# EasyEDA Pro project STM32-Environment-Monitor-SMD-DRAFT.epro

# Schematic Schematic1

## Sheets
1 P1: Assembly Variant: Basic; Board Name: Board1; Create Date: 2026-11-10; Page Name: P1; Project Name: 基于STM32的多功能环境智能监控系统; Schematic Name: Schematic1; Update Date: 2026-11-10; Company: 嘉立创EDA; Page Size: A4; Version: V1.0
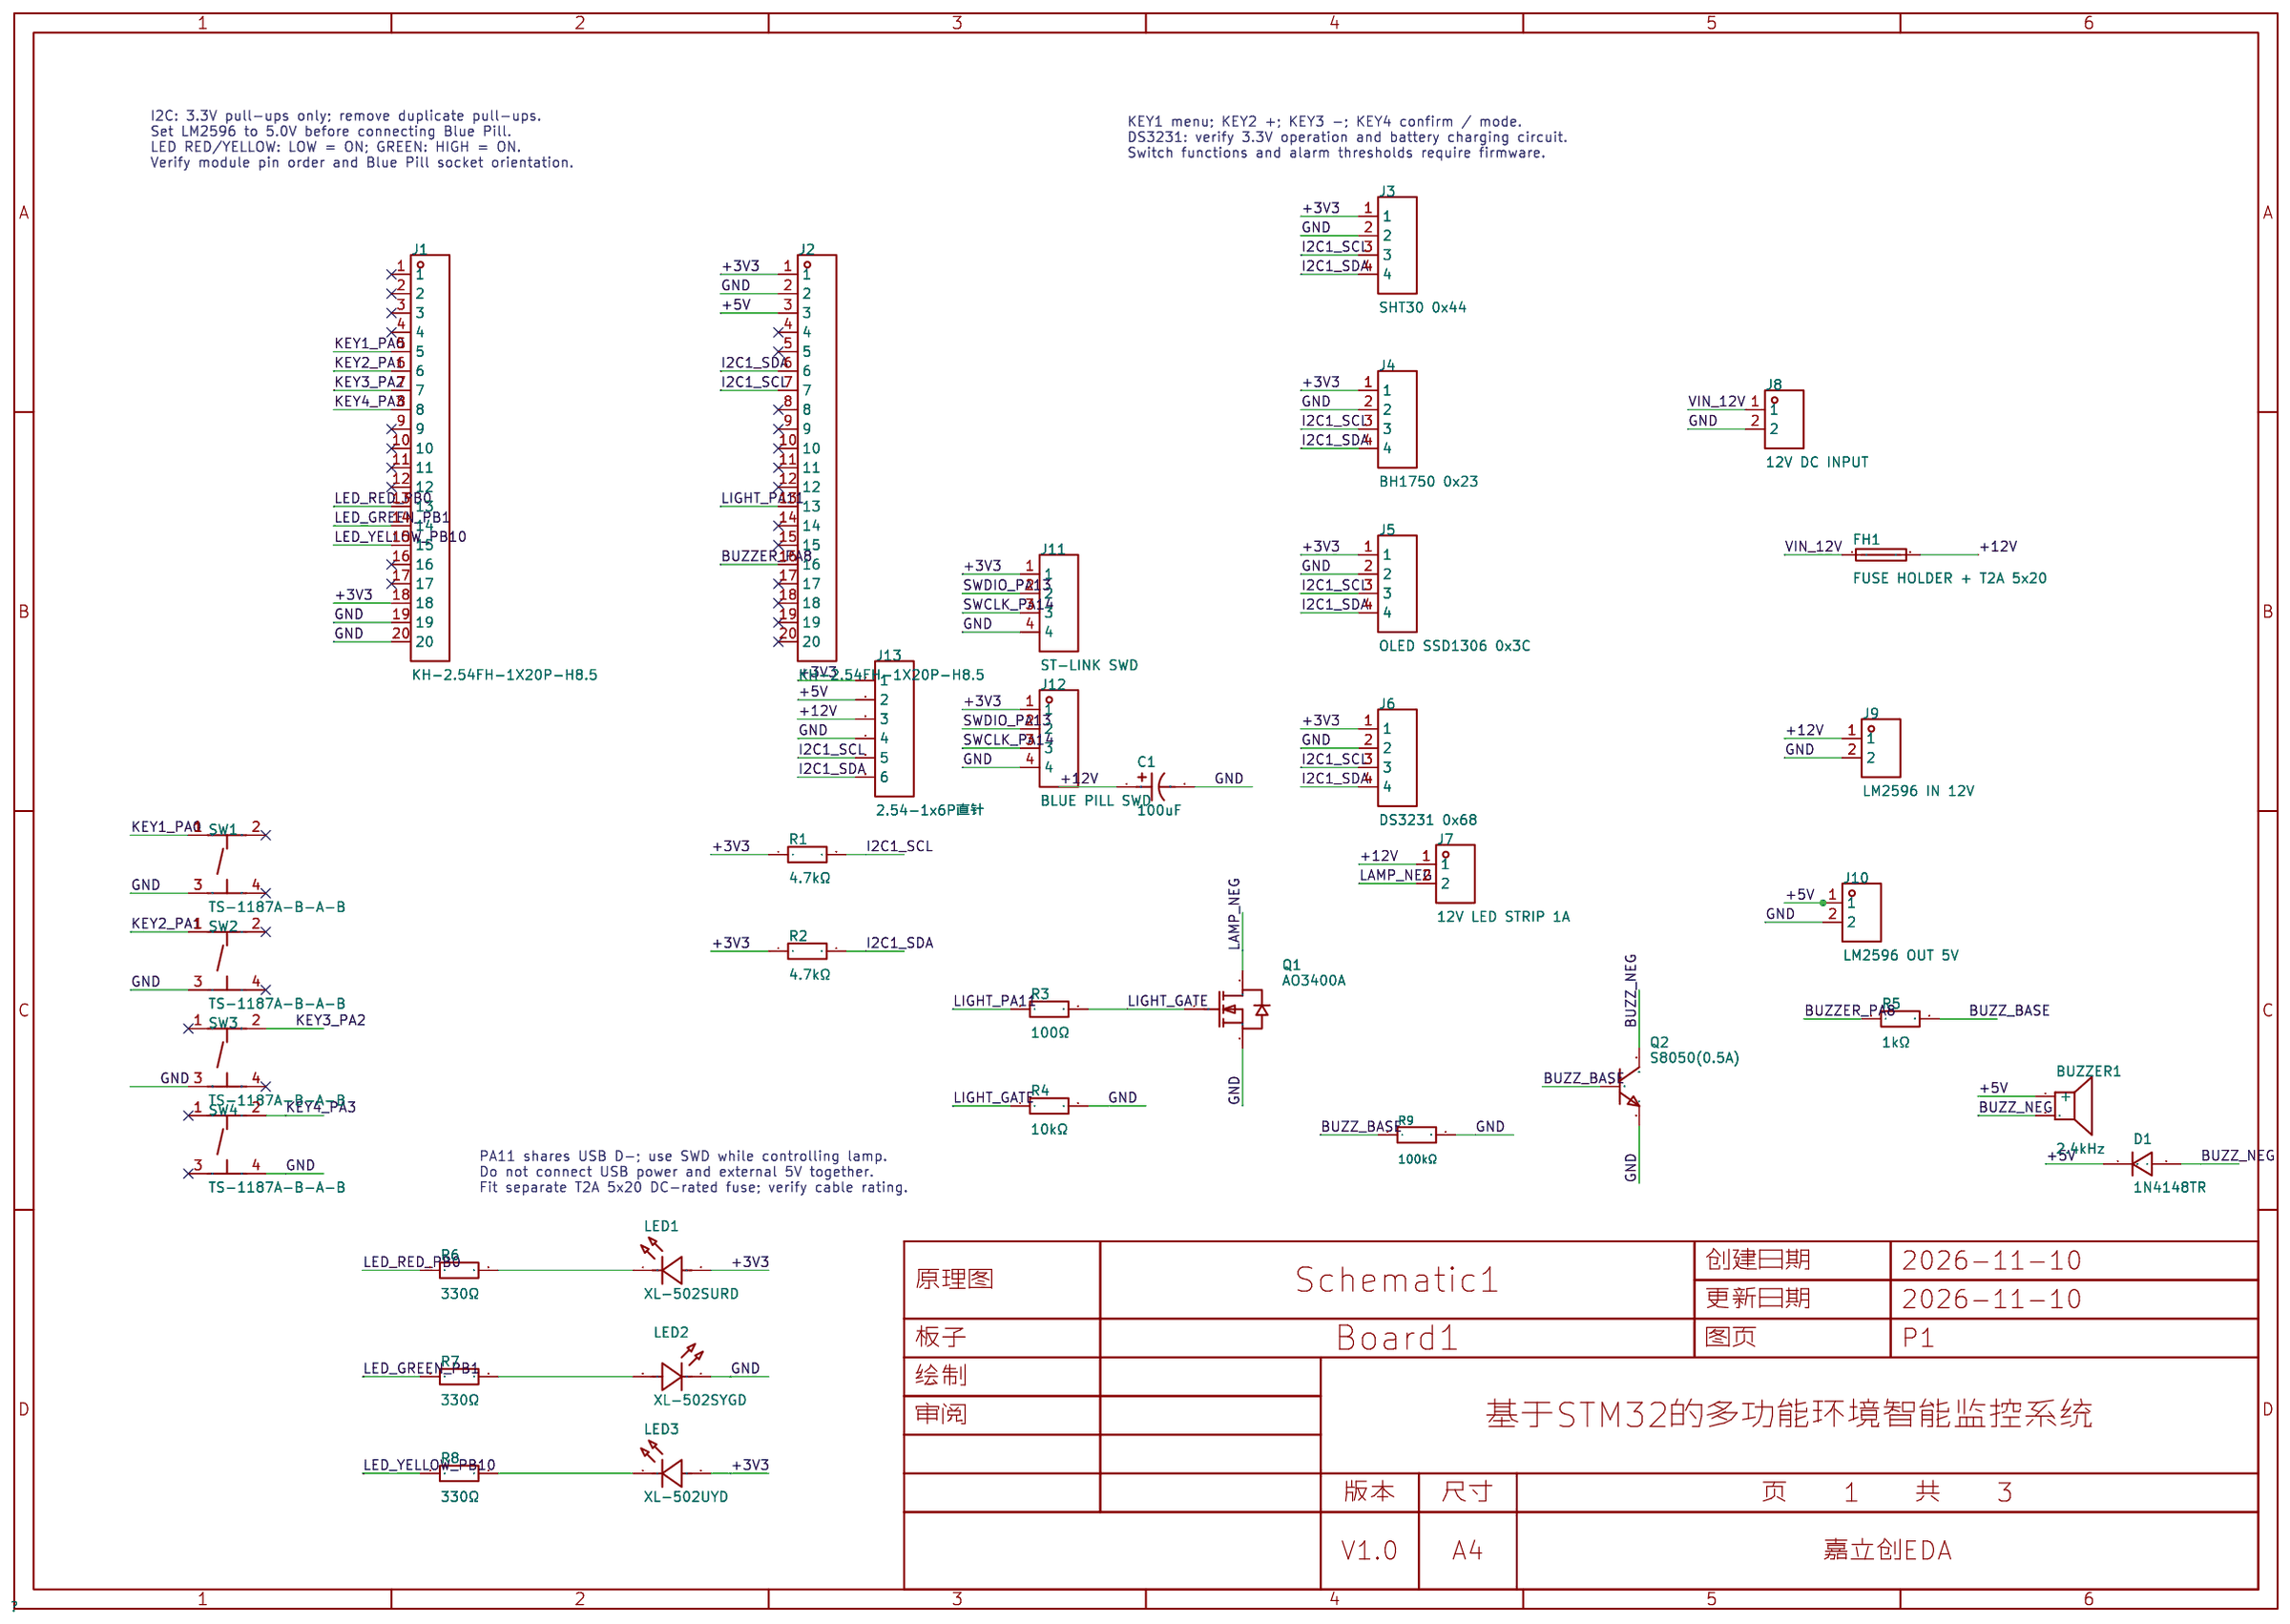
[diagram p0: P1]
2 P2: Create Date: 2026-11-12; Page Name: P2; Update Date: 2026-11-12
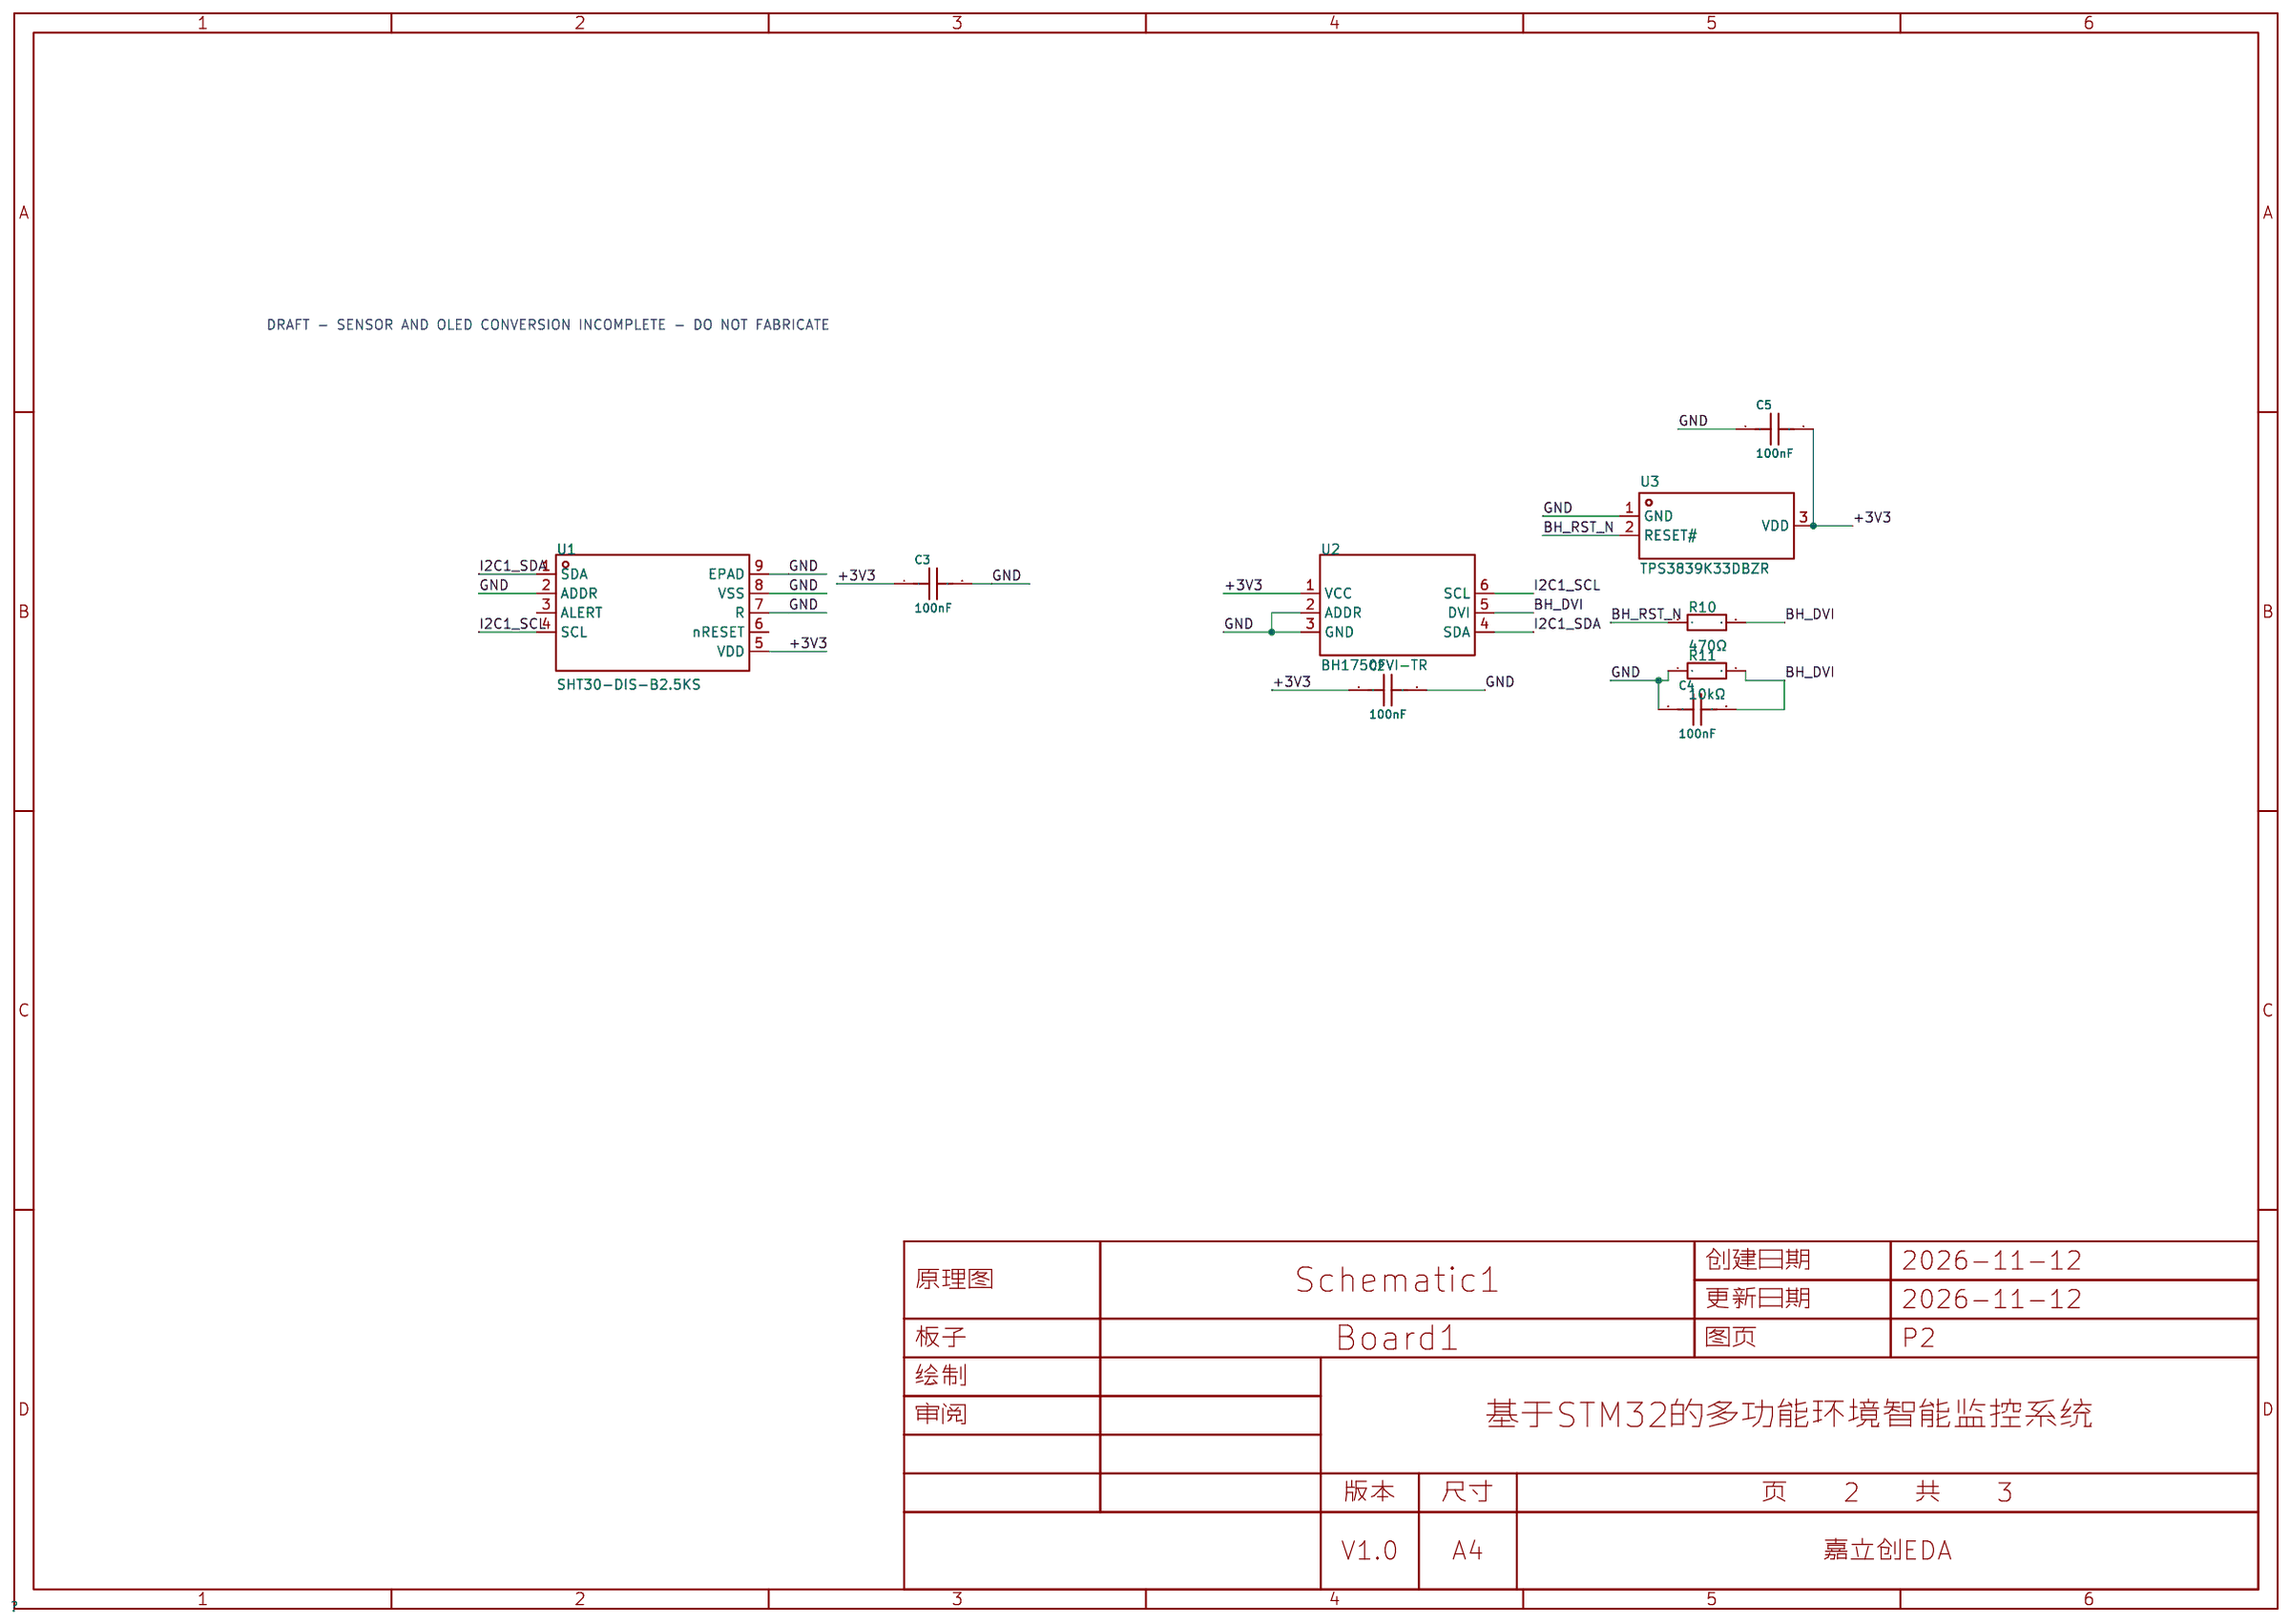
[diagram p1: P2]
3 P3: Create Date: 2026-11-12; Page Name: P3; Update Date: 2026-11-12
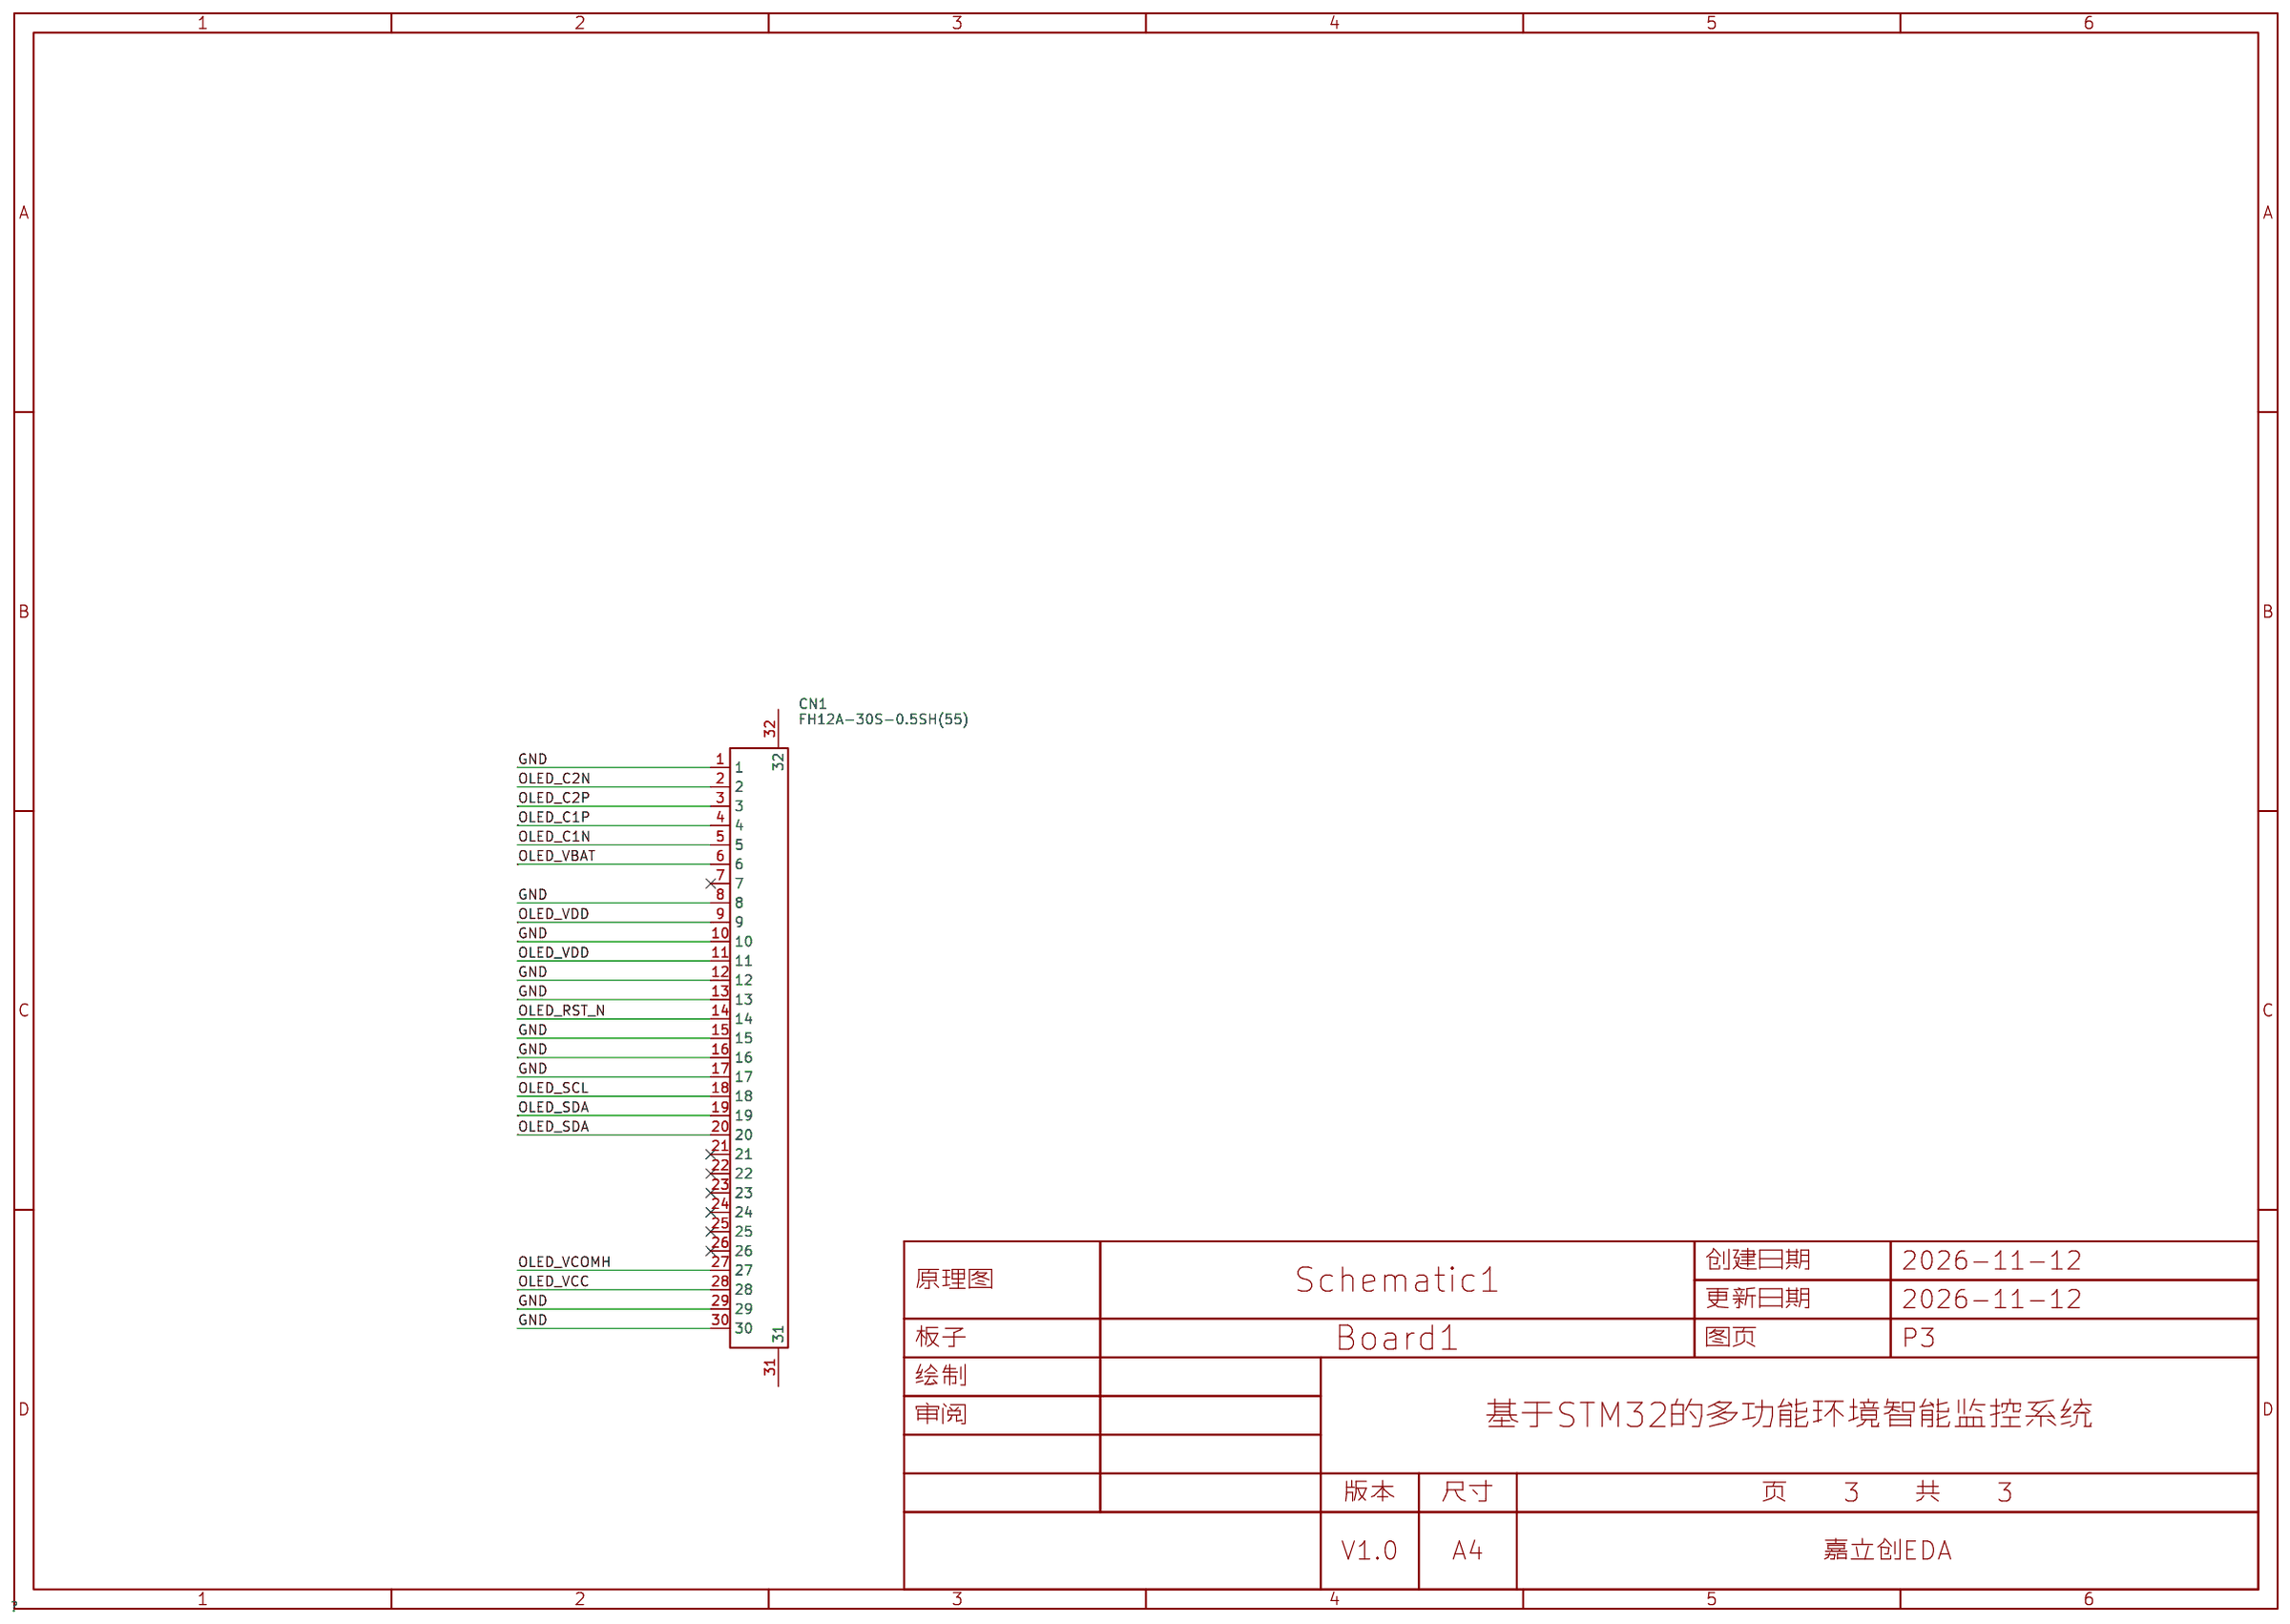
[diagram p2: P3]

## Parts
sheet P1
BUZZER1  2.4kHz  [BUZ-TH_BD12.0-P7.60-D0.6-FD]
C1  100uF  [CAP-TH_BD6.3-P2.50-D0.5-FD]
D1  1N4148TR  [DO-35_BD2.0-L4.2-P8.20-D0.5-RD]
FH1  FUSE HOLDER + T2A 5x20  [FUSE-TH_L24.8-W9.8-P22.60]
J1  KH-2.54FH-1X20P-H8.5  [HDR-TH_20P-P2.54-V-F-2]
J2  KH-2.54FH-1X20P-H8.5  [HDR-TH_20P-P2.54-V-F-2]
J3  SHT30 0x44  [HDR-TH_4P-P2.54-V-M]
J4  BH1750 0x23  [HDR-TH_4P-P2.54-V-M]
J5  OLED SSD1306 0x3C  [HDR-TH_4P-P2.54-V-M]
J6  DS3231 0x68  [HDR-TH_4P-P2.54-V-M]
J7  12V LED STRIP 1A  [CONN-TH_P5.00_KF301-5.0-2P]
J8  12V DC INPUT  [CONN-TH_P5.00_KF301-5.0-2P]
J9  LM2596 IN 12V  [CONN-TH_P5.00_KF301-5.0-2P]
J10  LM2596 OUT 5V  [CONN-TH_P5.00_KF301-5.0-2P]
J11  ST-LINK SWD  [HDR-TH_4P-P2.54-V-M]
J12  BLUE PILL SWD  [HDR-TH_4P-P2.54-V-F]
J13  2.54-1x6P直针  [HDR-TH_6P-P2.54-V-M-1]
LED1  XL-502SURD  [LED-TH_BD5.9-P2.54-RD_RED]
LED2  XL-502SYGD  [LED-TH_BD5.8-P2.54-RD]
LED3  XL-502UYD  [LED-TH_BD5.9-P2.54-RD_YELLOW]
Q1  AO3400A  [SOT-23-3_L2.9-W1.3-P1.90-LS2.4-BR]
Q2  S8050(0.5A)  [SOT-23-3_L2.9-W1.3-P1.90-LS2.4-BR]
R1  4.7kΩ  [R0603]
R2  4.7kΩ  [R0603]
R3  100Ω  [R0603]
R4  10kΩ  [R0603]
R5  1kΩ  [R0603]
R6  330Ω  [R0603]
R7  330Ω  [R0603]
R8  330Ω  [R0603]
R9  100kΩ  [R0603]
SW1  TS-1187A-B-A-B  [SW-SMD_4P-L5.1-W5.1-P3.70-LS6.5-TL_H1.5]
SW2  TS-1187A-B-A-B  [SW-SMD_4P-L5.1-W5.1-P3.70-LS6.5-TL_H1.5]
SW3  TS-1187A-B-A-B  [SW-SMD_4P-L5.1-W5.1-P3.70-LS6.5-TL_H1.5]
SW4  TS-1187A-B-A-B  [SW-SMD_4P-L5.1-W5.1-P3.70-LS6.5-TL_H1.5]
sheet P2
C2  100nF  [C0603]
C3  100nF  [C0603]
C4  100nF  [C0603]
C5  100nF  [C0603]
R10  470Ω  [R0603]
R11  10kΩ  [R0603]
U1  SHT30-DIS-B2.5KS  [DFN-8_L2.5-W2.5-P0.50-BL-EP]
U2  BH1750FVI-TR  [BH1750_WSOF6I_NO_CENTER_PAD_DRAFT]
U3  TPS3839K33DBZR  [SOT-23-3_L2.9-W1.3-P1.90-LS2.4-BR]
sheet P3
CN1  FH12A-30S-0.5SH(55)  [FPC-SMD_30P-P0.50_FH12A-30S-0.5SH]

## Library data of the parts
BUZZER1 = TMB12A05_C96093: 驱动方式:有源(内含驱动线路);构造类型:电磁式;额定电压:5V;频率:2.4kHz;声压(SPL):85dB;; LCSC Part Name: 有源(内含驱动线路) 电磁式 2.4kHz; Supplier Part: C96093; Manufacturer: 华能; Manufacturer Part: TMB12A05; Supplier Footprint: 插件,D=12mm; JLCPCB Part Class: Extended Part; Datasheet: https://item.szlcsc.com/datasheet/TMB12A05/97297.html; Supplier: LCSC; Driver Circuitry: 有源(内含驱动线路); Technology: 电磁式; Voltage Rating: 5V; Voltage - Supply: 4V~8V; Current Consumption: 30mA; Sound Pressure Level(SPL): 85dB; Diameter(φD): 12mm; Height: 9.8mm; Operating Temperature: -40℃~+85℃; Mounting Type: 插件
C1 = ERG25V100M6X7: 容值:100uF;精度:±20%;额定电压:25V;纹波电流:205mA@100kHz;等效串联电阻(ESR):600mΩ@100kHz;; LCSC Part Name: 100uF ±20% 25V; Supplier Part: C48935385; Manufacturer: JIERR(捷而瑞); Supplier Footprint: 插件,D6.3xL7mm; JLCPCB Part Class: Extended Part; Datasheet: https://item.szlcsc.com/datasheet/ERG25V100M6X7/51248505.html; Supplier: LCSC; Tolerance: ±20%; Voltage Rating: 25V; Ripple Current: 205mA@100kHz; Equivalent Series Resistance(ESR): 600mΩ@100kHz; Pin Spacing: 2.5mm; Diameter: 6.3mm; Height - Seated (Max): 7mm; Lifetime: 2000hrs@105℃; Operating Temperature: -40℃~+105℃; Polarity type: 有极性
D1 = 1N4148TR_C84410: 二极管配置:1个独立式;整流电流:200mA;直流反向耐压(Vr):100V;正向压降(Vf):1V@10mA;反向恢复时间(Trr):4ns;; LCSC Part Name: 100V 200mA; Supplier Part: C84410; Manufacturer: onsemi(安森美); Supplier Footprint: DO-35; JLCPCB Part Class: Extended Part; Datasheet: https://item.szlcsc.com/datasheet/1N4148TR/85580.html; Supplier: LCSC; Diode Configuration: 1个独立式; Pd - Power Dissipation: 500mW; Current - Rectified: 200mA; Voltage - DC Reverse(Vr): 100V; Voltage - Forward(Vf@If): 1V@10mA; Non-Repetitive Peak Forward Surge Current: 4A; Reverse Leakage Current (Ir): 5uA@75V; Reverse Recovery Time (trr): 4ns; Operating Junction Temperature Range: -55℃~+175℃@(Tj)
FH1 = FH1-200CK-G: 保险丝座类型:-;保险丝类型:-;; LCSC Part Name: 两件套 保险丝夹5*20绿色（两件套）; Supplier Part: C268204; Manufacturer: HONGJU(宏聚); Supplier Footprint: 插件,P=22.6mm; JLCPCB Part Class: Extended Part; Datasheet: https://item.szlcsc.com/datasheet/FH1-200CK-G/257711.html; Supplier: LCSC
J1 J2 = KH-2.54FH-1X20P-H8.5: 插孔结构:1x20P;间距:2.54mm;行距:-;圆孔/方孔:方孔;安装方式:直插;排数:单排;总孔位数:20P;额定电流:3A;额定电压:-;插孔方向:顶部;塑高:8.5mm;触头材质:黄铜;触头镀层:金;工作温度:-40℃~+105℃;; LCSC Part Name: 1x20P 间距:2.54mm 直插; Supplier Part: C2905423; Manufacturer: kinghelm(金航标); Supplier Footprint: 插件,P=2.54mm; JLCPCB Part Class: Extended Part; Datasheet: https://item.szlcsc.com/datasheet/KH-2.54FH-1X20P-H8.5/3175197.html; Supplier: LCSC; Holes Structure: 1x20P; Pitch: 2.54mm; Circular Hole / Square Hole: 方孔; Mounting Type: 直插; Number of Rows: 单排; Number of Positions: 20P; Current Rating: 3A; Holes Direction: 顶部; Insulation Height: 8.5mm; Contact Material: 黄铜; Contact Plating: 金; Operating Temperature: -40℃~+105℃; PIN Length: 3mm
J3-J6 J11 = HX PZ2.54-1x4P ZZ: 插针结构:1x4P;间距:2.54mm;行距:-;圆针/方针:方针;安装方式:直插;排数:单排;总PIN位数:4P;额定电流:3A;额定电压:1kV;配合针长度:6mm;塑高:2.5mm;端接针长度:3mm;触头材质:黄铜;触头镀层:金;工作温度:-40℃~+105℃;颜色:黑色;; LCSC Part Name: 1x4P 间距:2.54mm 方针 直插; Supplier Part: C32713270; Manufacturer: hanxia(韩下); Supplier Footprint: 插件,P=2.54mm; JLCPCB Part Class: Extended Part; Datasheet: https://item.szlcsc.com/datasheet/HX%2520PZ2.54-1x4P%2520ZZ/34444550.html; Supplier: LCSC; Pin Structure: 1x4P; Pitch: 2.54mm; Circluar Pins/Square Pins: 方针; Mounting Type: 直插; Number of Rows: 单排; Number of Pins: 4P; Current Rating: 3A; Voltage Rating (Max): 1kV; Length of Mating Pin: 6mm; Insulation Height: 2.5mm; Length of End Connection Pin: 3mm; Contact Material: 黄铜; Contact Plating: 金; Operating Temperature: -40℃~+105℃; Color: 黑色
J7-J10 = KF301-5.0-2P: 结构:1x2P;间距:5mm;颜色:蓝色;安装类型:直插;排数:1;每排PIN数:2;额定电流:17A;额定电压:250V;线规 - AWG:14~22;线规 - 平方毫米:1.5;工作温度:-30℃~+120℃;; LCSC Part Name: 1x2P 5mm 直插 排数:1 每排P数:2; Supplier Part: C474881; Manufacturer: KEFA(科发); Supplier Footprint: 插件,P=5mm; JLCPCB Part Class: Extended Part; Datasheet: https://item.szlcsc.com/datasheet/KF301-5.0-2P/481499.html; Supplier: LCSC; Number of Positions or Pins: 1x2P; Pitch: 5mm; Color: 蓝色; Mounting Type: 直插; Number of Pins: 2P; Number of Rows: 1; Number of PINs Per Row: 2; Screw Specification: M2.5; Current Rating: 17A; Voltage Rating (Max): 250V; Wire Gauge - AWG: 14~22; Wire Gauge - mm2: 1.5; Operating Temperature: -30℃~+120℃; Height Above Board: 10mm
J12 = 2.54-1*4P母: 插孔结构:1x4P;间距:2.54mm;行距:-;圆孔/方孔:方孔;安装方式:直插;排数:单排;总孔位数:4P;额定电流:3A;额定电压:-;插孔方向:顶部;塑高:8.5mm;触头材质:青铜;触头镀层:金;工作温度:-40℃~+105℃;; LCSC Part Name: 1x4P 间距:2.54mm 直插; Supplier Part: C2718488; Manufacturer: BOOMELE(博穆精密); Supplier Footprint: 插件,P=2.54mm; JLCPCB Part Class: Extended Part; Datasheet: https://item.szlcsc.com/datasheet/2.54-1*4P%25E6%25AF%258D/2834502.html; Supplier: LCSC; Holes Structure: 1x4P; Pitch: 2.54mm; Circular Hole / Square Hole: 方孔; Mounting Type: 直插; Number of Rows: 单排; Number of Positions: 4P; Current Rating: 3A; Holes Direction: 顶部; Insulation Height: 8.5mm; Contact Material: 青铜; Contact Plating: 金; Operating Temperature: -40℃~+105℃; PIN Length: 3.2mm
J13 = 2.54-1x6P直针: 插针结构:1x6P;间距:2.54mm;行距:-;圆针/方针:方针;安装方式:直插;排数:单排;总PIN位数:6P;额定电流:3A;额定电压:-;配合针长度:5.7mm;塑高:2.5mm;端接针长度:3mm;触头材质:黄铜;触头镀层:金;工作温度:-40℃~+105℃;颜色:黑色;; LCSC Part Name: 1x6P 间距:2.54mm 方针 直插; Supplier Part: C37208; Manufacturer: BOOMELE(博穆精密); Supplier Footprint: 插件,P=2.54mm; JLCPCB Part Class: Extended Part; Datasheet: https://item.szlcsc.com/datasheet/2.54-1x6P%25E7%259B%25B4%25E9%2592%2588/38187.html; Supplier: LCSC; Pin Structure: 1x6P; Pitch: 2.54mm; Circluar Pins/Square Pins: 方针; Mounting Type: 直插; Number of Rows: 单排; Number of Pins: 6P; Current Rating: 3A; Length of Mating Pin: 5.7mm; Insulation Height: 2.5mm; Length of End Connection Pin: 3mm; Contact Material: 黄铜; Contact Plating: 金; Operating Temperature: -40℃~+105℃; Color: 黑色
LED1 = XL-502SURD: 灯头类型:5mm圆形灯头;发光颜色:红色;正向压降(Vf):2.4V;功率:70mW;测试电流:20mA;波长:615nm~625nm;二极管配置:-;透镜颜色:红色透镜;色温:-;发光强度:300mcd;发光角度:35°;载带方式:-;工作温度:-25℃~+85℃;; LCSC Part Name: 5mm圆形灯头 红色; Supplier Part: C2895492; Manufacturer: XINGLIGHT(成兴光); Supplier Footprint: 插件,D=5mm; JLCPCB Part Class: Extended Part; Datasheet: https://item.szlcsc.com/datasheet/XL-502SURD/3136207.html; Supplier: LCSC; Lamp Holder Type: 5mm圆形灯头; Illumination Color: 红色; Voltage - Forward(Vf): 2.4V; Power(Watts): 70mW; Test Current: 20mA; Wavelength - Dominant: 615nm~625nm; Peak Wavelength: 654nm; Lens Color: 红色透镜; Luminous Intensity: 300mcd; Viewing Angle: 35°; Operating Temperature: -25℃~+85℃
LED2 = XL-502SYGD: 灯头类型:5mm圆形灯头;发光颜色:黄绿色;正向压降(Vf):2.3V;功率:50mW;正向电流:20mA;波长:560nm~580nm;二极管配置:-;透镜颜色:绿色透镜;色温:-;发光强度:300mcd;发光角度:25°;载带方式:-;工作温度:-20℃~+85℃;; LCSC Part Name: 绿发普绿短脚; Supplier Part: C2895550; Manufacturer: XINGLIGHT(成兴光); Supplier Footprint: 插件,D=5mm; JLCPCB Part Class: Extended Part; Datasheet: https://item.szlcsc.com/datasheet/XL-502SYGD/3136215.html; Supplier: LCSC; Lamp Holder Type: 5mm圆形灯头; Illumination Color: 黄绿色; Voltage - Forward(Vf): 2.3V; Power(Watts): 50mW; Forward Current: 20mA; Wavelength - Dominant: 560nm~580nm; Peak Wavelength: 570nm; Lens Color: 绿色透镜; Luminous Intensity: 300mcd; Viewing Angle: 25°; Operating Temperature: -20℃~+85℃
LED3 = XL-502UYD: 灯头类型:5mm圆形灯头;发光颜色:黄色;正向压降(Vf):2.2V;功率:50mW;正向电流:20mA;波长:585nm~595nm;二极管配置:-;透镜颜色:黄色透镜;色温:-;发光强度:1cd;发光角度:25°;载带方式:-;工作温度:-20℃~+85℃;; LCSC Part Name: 5mm圆形灯头 黄色; Supplier Part: C2895494; Manufacturer: XINGLIGHT(成兴光); Supplier Footprint: 插件,D=5mm; JLCPCB Part Class: Extended Part; Datasheet: https://item.szlcsc.com/datasheet/XL-502UYD/3136209.html; Supplier: LCSC; Lamp Holder Type: 5mm圆形灯头; Illumination Color: 黄色; Voltage - Forward(Vf): 2.2V; Power(Watts): 50mW; Forward Current: 20mA; Wavelength - Dominant: 585nm~595nm; Peak Wavelength: 588nm; Lens Color: 黄色透镜; Luminous Intensity: 1cd; Viewing Angle: 25°; Operating Temperature: -20℃~+85℃
Q1 = AO3400A_C20917: 数量:1个N沟道;漏源电压(Vdss):30V;连续漏极电流(Id):5.7A;导通电阻(RDS(on)):48mΩ@2.5V;耗散功率(Pd):1.4W;阈值电压(Vgs(th)):1.45V;; LCSC Part Name: N沟道 耐压:30V; Supplier Part: C20917; Manufacturer: AOS; Supplier Footprint: SOT-23; JLCPCB Part Class: Basic Part; Datasheet: https://item.szlcsc.com/datasheet/AO3400A/21629.html; Supplier: LCSC; Number: 1个N沟道; Drain to Source Voltage: 30V; Current - Continuous Drain(Id): 5.7A; RDS(on): 48mΩ@2.5V; Pd - Power Dissipation: 1.4W; Gate Threshold Voltage (Vgs(th)): 1.45V; Gate Charge(Qg): 7nC@10V; Input Capacitance(Ciss): 630pF; Reverse Transfer Capacitance (Crss@Vds): 50pF; Operating Temperature: -55℃~+150℃; Type: N沟道; Output Capacitance(Coss): 75pF; Vgs: ±12V
Q2 = S8050(0.5A): 晶体管类型:NPN;集电极电流(Ic):500mA;集射极击穿电压(Vceo):25V;耗散功率(Pd):300mW;直流电流增益(hFE):120;; LCSC Part Name: 电流:0.5A 电压:25V; Supplier Part: C3014350; Manufacturer: EIC; Supplier Footprint: SOT-23; JLCPCB Part Class: Extended Part; Datasheet: https://item.szlcsc.com/datasheet/S8050(0.5A)/3524496.html; Supplier: LCSC; type: NPN; Current - Collector(Ic): 500mA; Collector - Emitter Voltage VCEO: 25V; Pd - Power Dissipation: 300mW; DC Current Gain: 120; Transition frequency(fT): 150MHz; Current - Collector Cutoff: 100nA; Vce Saturation(VCE(sat)): 600mV; Emitter-Base Voltage(Vebo): 5V; Number: 1个NPN; Configuration: 独立式
R1 R2 = 0603WAF4701T5E: 电阻类型:厚膜电阻;阻值:4.7kΩ;精度:±1%;功率:100mW;工作电压:75V;温度系数:±100ppm/℃;; LCSC Part Name: 厚膜电阻 4.7kΩ ±1%; Supplier Part: C23162; Manufacturer: UNI-ROYAL(厚声); Supplier Footprint: 0603; JLCPCB Part Class: Basic Part; Datasheet: https://item.szlcsc.com/datasheet/0603WAF4701T5E/23889.html; Supplier: LCSC; Type: 厚膜电阻; Tolerance: ±1%; Power(Watts): 100mW; Voltage-Supply(Max): 75V; Temperature Coefficient: ±100ppm/℃; Operating Temperature: -55℃~+155℃
R3 = 0603WAF1000T5E: 电阻类型:厚膜电阻;阻值:100Ω;精度:±1%;功率:100mW;最大工作电压:75V;温度系数:±200ppm/℃;; LCSC Part Name: 100Ω ±1% 100mW 厚膜电阻; Supplier Part: C22775; Manufacturer: UNI-ROYAL(厚声); Supplier Footprint: 0603; JLCPCB Part Class: Basic Part; Datasheet: https://atta.szlcsc.com/upload/public/pdf/source/20200306/C422600_1E6D84923E4A46A82E41ADD87F860B5C.pdf; Supplier: LCSC; Type: 厚膜电阻; Tolerance: ±1%; Power(Watts): 100mW; Overload Voltage (Max): 75V; Temperature Coefficient: ±200ppm/℃; Operating Temperature Range: -55℃~+155℃
R4 R11 = 0603WAF1002T5E: 电阻类型:厚膜电阻;阻值:10kΩ;精度:±1%;功率:100mW;工作电压:75V;温度系数:±100ppm/℃;; LCSC Part Name: 厚膜电阻 10kΩ ±1% 100mW; Supplier Part: C25804; Manufacturer: UNI-ROYAL(厚声); Supplier Footprint: 0603; JLCPCB Part Class: Basic Part; Datasheet: https://item.szlcsc.com/datasheet/0603WAF1002T5E/26547.html; Supplier: LCSC; Type: 厚膜电阻; Tolerance: ±1%; Power(Watts): 100mW; Voltage-Supply(Max): 75V; Temperature Coefficient: ±100ppm/℃; Operating Temperature: -55℃~+155℃
R5 = 0603WAF1001T5E: 电阻类型:厚膜电阻;阻值:1kΩ;精度:±1%;功率:100mW;工作电压:75V;温度系数:±100ppm/℃;; LCSC Part Name: 1kΩ ±1% 100mW 厚膜电阻; Supplier Part: C21190; Manufacturer: UNI-ROYAL(厚声); Supplier Footprint: 0603; JLCPCB Part Class: Basic Part; Datasheet: https://item.szlcsc.com/datasheet/0603WAF1001T5E/21904.html; Supplier: LCSC; Type: 厚膜电阻; Tolerance: ±1%; Power(Watts): 100mW; Voltage-Supply(Max): 75V; Temperature Coefficient: ±100ppm/℃; Operating Temperature: -55℃~+155℃
R6-R8 = 0603WAF3300T5E: 电阻类型:厚膜电阻;阻值:330Ω;精度:±1%;功率:100mW;最大工作电压:75V;温度系数:±100ppm/℃;; LCSC Part Name: 330Ω ±1% 100mW 厚膜电阻; Supplier Part: C23138; Manufacturer: UNI-ROYAL(厚声); Supplier Footprint: 0603; JLCPCB Part Class: Basic Part; Datasheet: https://atta.szlcsc.com/upload/public/pdf/source/20200306/C422600_1E6D84923E4A46A82E41ADD87F860B5C.pdf; Supplier: LCSC; Type: 厚膜电阻; Tolerance: ±1%; Power(Watts): 100mW; Overload Voltage (Max): 75V; Temperature Coefficient: ±100ppm/℃; Operating Temperature Range: -55℃~+155℃
R9 = 0603WAF1003T5E: 电阻类型:厚膜电阻;阻值:100kΩ;精度:±1%;功率:100mW;工作电压:75V;温度系数:±100ppm/℃;; LCSC Part Name: 厚膜电阻 100kΩ ±1% 100mW; Supplier Part: C25803; Manufacturer: UNI-ROYAL(厚声); Supplier Footprint: 0603; JLCPCB Part Class: Basic Part; Datasheet: https://item.szlcsc.com/datasheet/0603WAF1003T5E/26546.html; Supplier: LCSC; Type: 厚膜电阻; Tolerance: ±1%; Power(Watts): 100mW; Voltage-Supply(Max): 75V; Temperature Coefficient: ±100ppm/℃; Operating Temperature: -55℃~+155℃
SW1-SW4 = TS-1187A-B-A-B: 电路结构:单刀单掷;按钮形状:圆形按钮;作用力:1.6N;安装方式:立贴;开关长度:5.1mm;开关宽度:5.1mm;开关高度:1.5mm;带支架:不带支架;触点电流:50mA;额定电压:12V;带灯:无;工作寿命:10万次;; LCSC Part Name: 5.1*5.1*1.5mm 立贴 轻触开关; Supplier Part: C318884; Manufacturer: XKB Connection(中国星坤); Supplier Footprint: SMD-4P,5.1x5.1mm; JLCPCB Part Class: Basic Part; Datasheet: https://item.szlcsc.com/datasheet/TS-1187A-B-A-B/299976.html; Supplier: LCSC; Circuit: 单刀单掷; Actuator Style: 圆形按钮; Operating Force: 1.6N; Mounting Type: 立贴; Length: 5.1mm; Width: 5.1mm; Switch Height: 1.5mm; with Bracket: 不带支架; Contact Current: 50mA; Voltage Rating: 12V; Actuator/Cap Color: 金色; With Lamp: 无; Life: 10万次; Operating Temperature: -30℃~+85℃
C2-C5 = CC0603KRX7R9BB104: 容值:100nF;精度:±10%;额定电压:50V;温度系数:X7R;; LCSC Part Name: 100nF ±10% 50V; Supplier Part: C14663; Manufacturer: YAGEO(国巨); Supplier Footprint: 0603; JLCPCB Part Class: Basic Part; Datasheet: https://item.szlcsc.com/datasheet/CC0603KRX7R9BB104/15331.html; Supplier: LCSC; Tolerance: ±10%; Voltage Rating: 50V; Temperature Coefficient: X7R
R10 = 0603WAF4700T5E: 电阻类型:厚膜电阻;阻值:470Ω;精度:±1%;功率:100mW;工作电压:75V;温度系数:±100ppm/℃;; LCSC Part Name: 厚膜电阻 470Ω ±1%; Supplier Part: C23179; Manufacturer: UNI-ROYAL(厚声); Supplier Footprint: 0603; JLCPCB Part Class: Basic Part; Datasheet: https://item.szlcsc.com/datasheet/0603WAF4700T5E/23906.html; Supplier: LCSC; Type: 厚膜电阻; Tolerance: ±1%; Power(Watts): 100mW; Voltage-Supply(Max): 75V; Temperature Coefficient: ±100ppm/℃; Operating Temperature: -55℃~+155℃
U1 = SHT30-DIS-B2.5KS: 温度范围:-40℃~+125℃;湿度范围:0%RH~100%RH;接口类型:I2C;湿度精度:±2%RH;; LCSC Part Name: 1-101400-01 1-101400-01 ±2%数字温湿度传感器（10-90%RH）; Supplier Part: C77361; Manufacturer: Sensirion(瑞士盛思锐); Supplier Footprint: DFN-8-EP(2.5x2.5); JLCPCB Part Class: Extended Part; Datasheet: https://item.szlcsc.com/datasheet/SHT30-DIS-B2.5KS/78489.html; Supplier: LCSC; Temperature Range: -40℃~+125℃; Humidity: 0%RH~100%RH; Interface: I2C; Voltage - Supply: 2.15V~5.5V; Current - Supply: 200nA; Humidity Tolerance: ±2%RH; Temperature Tolerance: ±0.2℃; Resolution: 16bit; Features: 温度补偿；工厂校准
U2 = BH1750FVI_TR_6PIN_DRAFT: 检测颜色:-;接口类型:I2C;分辨率:16bit;; LCSC Part Name: 数字16位串行输出环境光传感器IC; Supplier Part: C78960; Manufacturer: ROHM(罗姆); Supplier Footprint: WSOF-6; JLCPCB Part Class: 扩展库; Datasheet: https://item.szlcsc.com/datasheet/BH1750FVI-TR/80097.html; Supplier: LCSC; Measurement Type: 光强; Photoperceptivity: 65.535klx; Interface: I2C; Resolution(Bits): 16bit; Voltage - Supply: 2.4V~3.6V; Quiescent Current: 10nA; Operating Temperature: -40℃~+85℃; Length: 2.6mm; Width: 1.6mm; Height: 0.75mm; Features: 光谱校正/滤光；低功耗/睡眠模式
U3 = TPS3839K33DBZR: 工作电压:900mV~6.5V;复位有效电平:低电平有效;受监控电压数:1;复位超时:200ms;; LCSC Part Name: 150-nA超低功耗电源电压监控器; Supplier Part: C96333; Manufacturer: TI(德州仪器); Supplier Footprint: SOT-23; JLCPCB Part Class: Extended Part; Datasheet: https://www.ti.com/cn/lit/ds/symlink/tps3839.pdf; Supplier: LCSC; ChipType: 电压监控器; Output Type: 推挽; Voltage - Supply: 900mV~6.5V; Reset Active Level: 低电平有效; Threshold Voltage: 2.93V; Number of Voltages Monitored: 1; Reset Timeout: 200ms; Operating Temperature: -40℃~+85℃; Quiescent Current: 150nA
CN1 = FH12A-30S-0.5SH(55): 锁定特性:翻盖式;触点类型:上接;触点数量:30P;间距:0.5mm;安装方式:卧贴;工作温度:-40℃~+85℃;; LCSC Part Name: 间距:0.5mm P数:30P 翻盖式 上接; Supplier Part: C3036214; Manufacturer: HRS(广濑); Supplier Footprint: SMD,P=0.5mm,卧贴; JLCPCB Part Class: Extended Part; Datasheet: https://item.szlcsc.com/datasheet/FH12A-30S-0.5SH(55)/3586811.html; Supplier: LCSC; Locking Feature: 翻盖式; Contact Type: 上接; Number of Contacts: 30P; Pitch: 0.5mm; Mounting Type: 卧贴; FFC, FCB Thickness: 0.3mm; Height Above Board: 2mm; Contact Material: 磷青铜; Contact Plating: 金; Operating Temperature: -40℃~+85℃

## Nets
+3V3: C2.1 C3.1 C5.2 J1.18 J2.1 J3.1 J4.1 J5.1 J6.1 J11.1 J12.1 J13.1 LED1.2(A) LED3.2(A) R1.1 R2.1 U1.5(VDD) U2.1(VCC) U3.3(VDD)
+5V: BUZZER1.1(+) D1.1(C) J2.3 J10.1 J13.2
+12V: C1.1 FH1.2 J7.1 J9.1 J13.3
GND: C1.2 C2.2 C3.2 C4.1 C5.1 CN1.1 CN1.8 CN1.10 CN1.12 CN1.13 CN1.15 CN1.16 CN1.17 CN1.29 CN1.30 J1.19 J1.20 J2.2 J3.2 J4.2 J5.2 J6.2 J8.2 J9.2 J10.2 J11.4 J12.4 J13.4 LED2.1(K) Q1.2(S) Q2.2(E) R4.2 R9.2 R11.1 SW1.3(C) SW2.3(C) SW3.3(C) SW4.4(D) U1.2(ADDR) U1.7(R) U1.8(VSS) U1.9(EPAD) U2.2(ADDR) U2.3(GND) U3.1(GND)
VIN_12V: FH1.1 J8.1
BH_DVI: C4.2 R10.2 R11.2 U2.5(DVI)
BH_RST_N: R10.1 U3.2(RESET#)
BUZZ_BASE: Q2.1(B) R5.2 R9.1
BUZZ_NEG: BUZZER1.2 D1.2(A) Q2.3(C)
BUZZER_PA8: J2.16 R5.1
I2C1_SCL: J2.7 J3.3 J4.3 J5.3 J6.3 J13.5 R1.2 U1.4(SCL) U2.6(SCL)
I2C1_SDA: J2.6 J3.4 J4.4 J5.4 J6.4 J13.6 R2.2 U1.1(SDA) U2.4(SDA)
KEY1_PA0: J1.5 SW1.1(A)
KEY2_PA1: J1.6 SW2.1(A)
KEY3_PA2: J1.7 SW3.2(B)
KEY4_PA3: J1.8 SW4.2(B)
LAMP_NEG: J7.2 Q1.3(D)
LED_GREEN_PB1: J1.14 R7.1
LED_RED_PB0: J1.13 R6.1
LED_YELLOW_PB10: J1.15 R8.1
LIGHT_GATE: Q1.1(G) R3.2 R4.1
LIGHT_PA11: J2.13 R3.1
OLED_C1N: CN1.5
OLED_C1P: CN1.4
OLED_C2N: CN1.2
OLED_C2P: CN1.3
OLED_RST_N: CN1.14
OLED_SCL: CN1.18
OLED_SDA: CN1.19 CN1.20
OLED_VBAT: CN1.6
OLED_VCC: CN1.28
OLED_VCOMH: CN1.27
OLED_VDD: CN1.9 CN1.11
SWCLK_PA14: J11.3 J12.3
SWDIO_PA13: J11.2 J12.2
$1N72: LED1.1(K) R6.2
$1N73: LED2.2(A) R7.2
$1N74: LED3.1(K) R8.2

Not connected (* = marked no-connect by the designer): CN1 7* 21* 22* 23* 24* 25* 26* 31 32; J1 1* 2* 3* 4* 9* 10* 11* 12* 16* 17*; J2 4* 5* 8* 9* 10* 11* 12* 14* 15* 17* 18* 19* 20*; SW1 2(B)* 4(D)*; SW2 2(B)* 4(D)*; SW3 1(A)* 4(D)*; SW4 1(A)* 3(C)*; U1 3(ALERT) 6(nRESET)

## Notes on the sheets
sheet 1
- I2C: 3.3V pull-ups only; remove duplicate pull-ups.
  Set LM2596 to 5.0V before connecting Blue Pill.
  LED RED/YELLOW: LOW = ON; GREEN: HIGH = ON.
  Verify module pin order and Blue Pill socket orientation.
- KEY1 menu; KEY2 +; KEY3 -; KEY4 confirm / mode.
  DS3231: verify 3.3V operation and battery charging circuit.
  Switch functions and alarm thresholds require firmware.
- PA11 shares USB D-; use SWD while controlling lamp.
  Do not connect USB power and external 5V together.
  Fit separate T2A 5x20 DC-rated fuse; verify cable rating.
sheet 2
- DRAFT - SENSOR AND OLED CONVERSION INCOMPLETE - DO NOT FABRICATE

# Schematic Schematic2
Assembly Variant: Basic; Create Date: 2026-11-09; Page Name: P1; Project Name: 基于STM32的多功能环境智能监控系统; Schematic Name: Schematic2; Update Date: 2026-11-09; Company: 嘉立创EDA; Page Size: A4; Version: V1.0
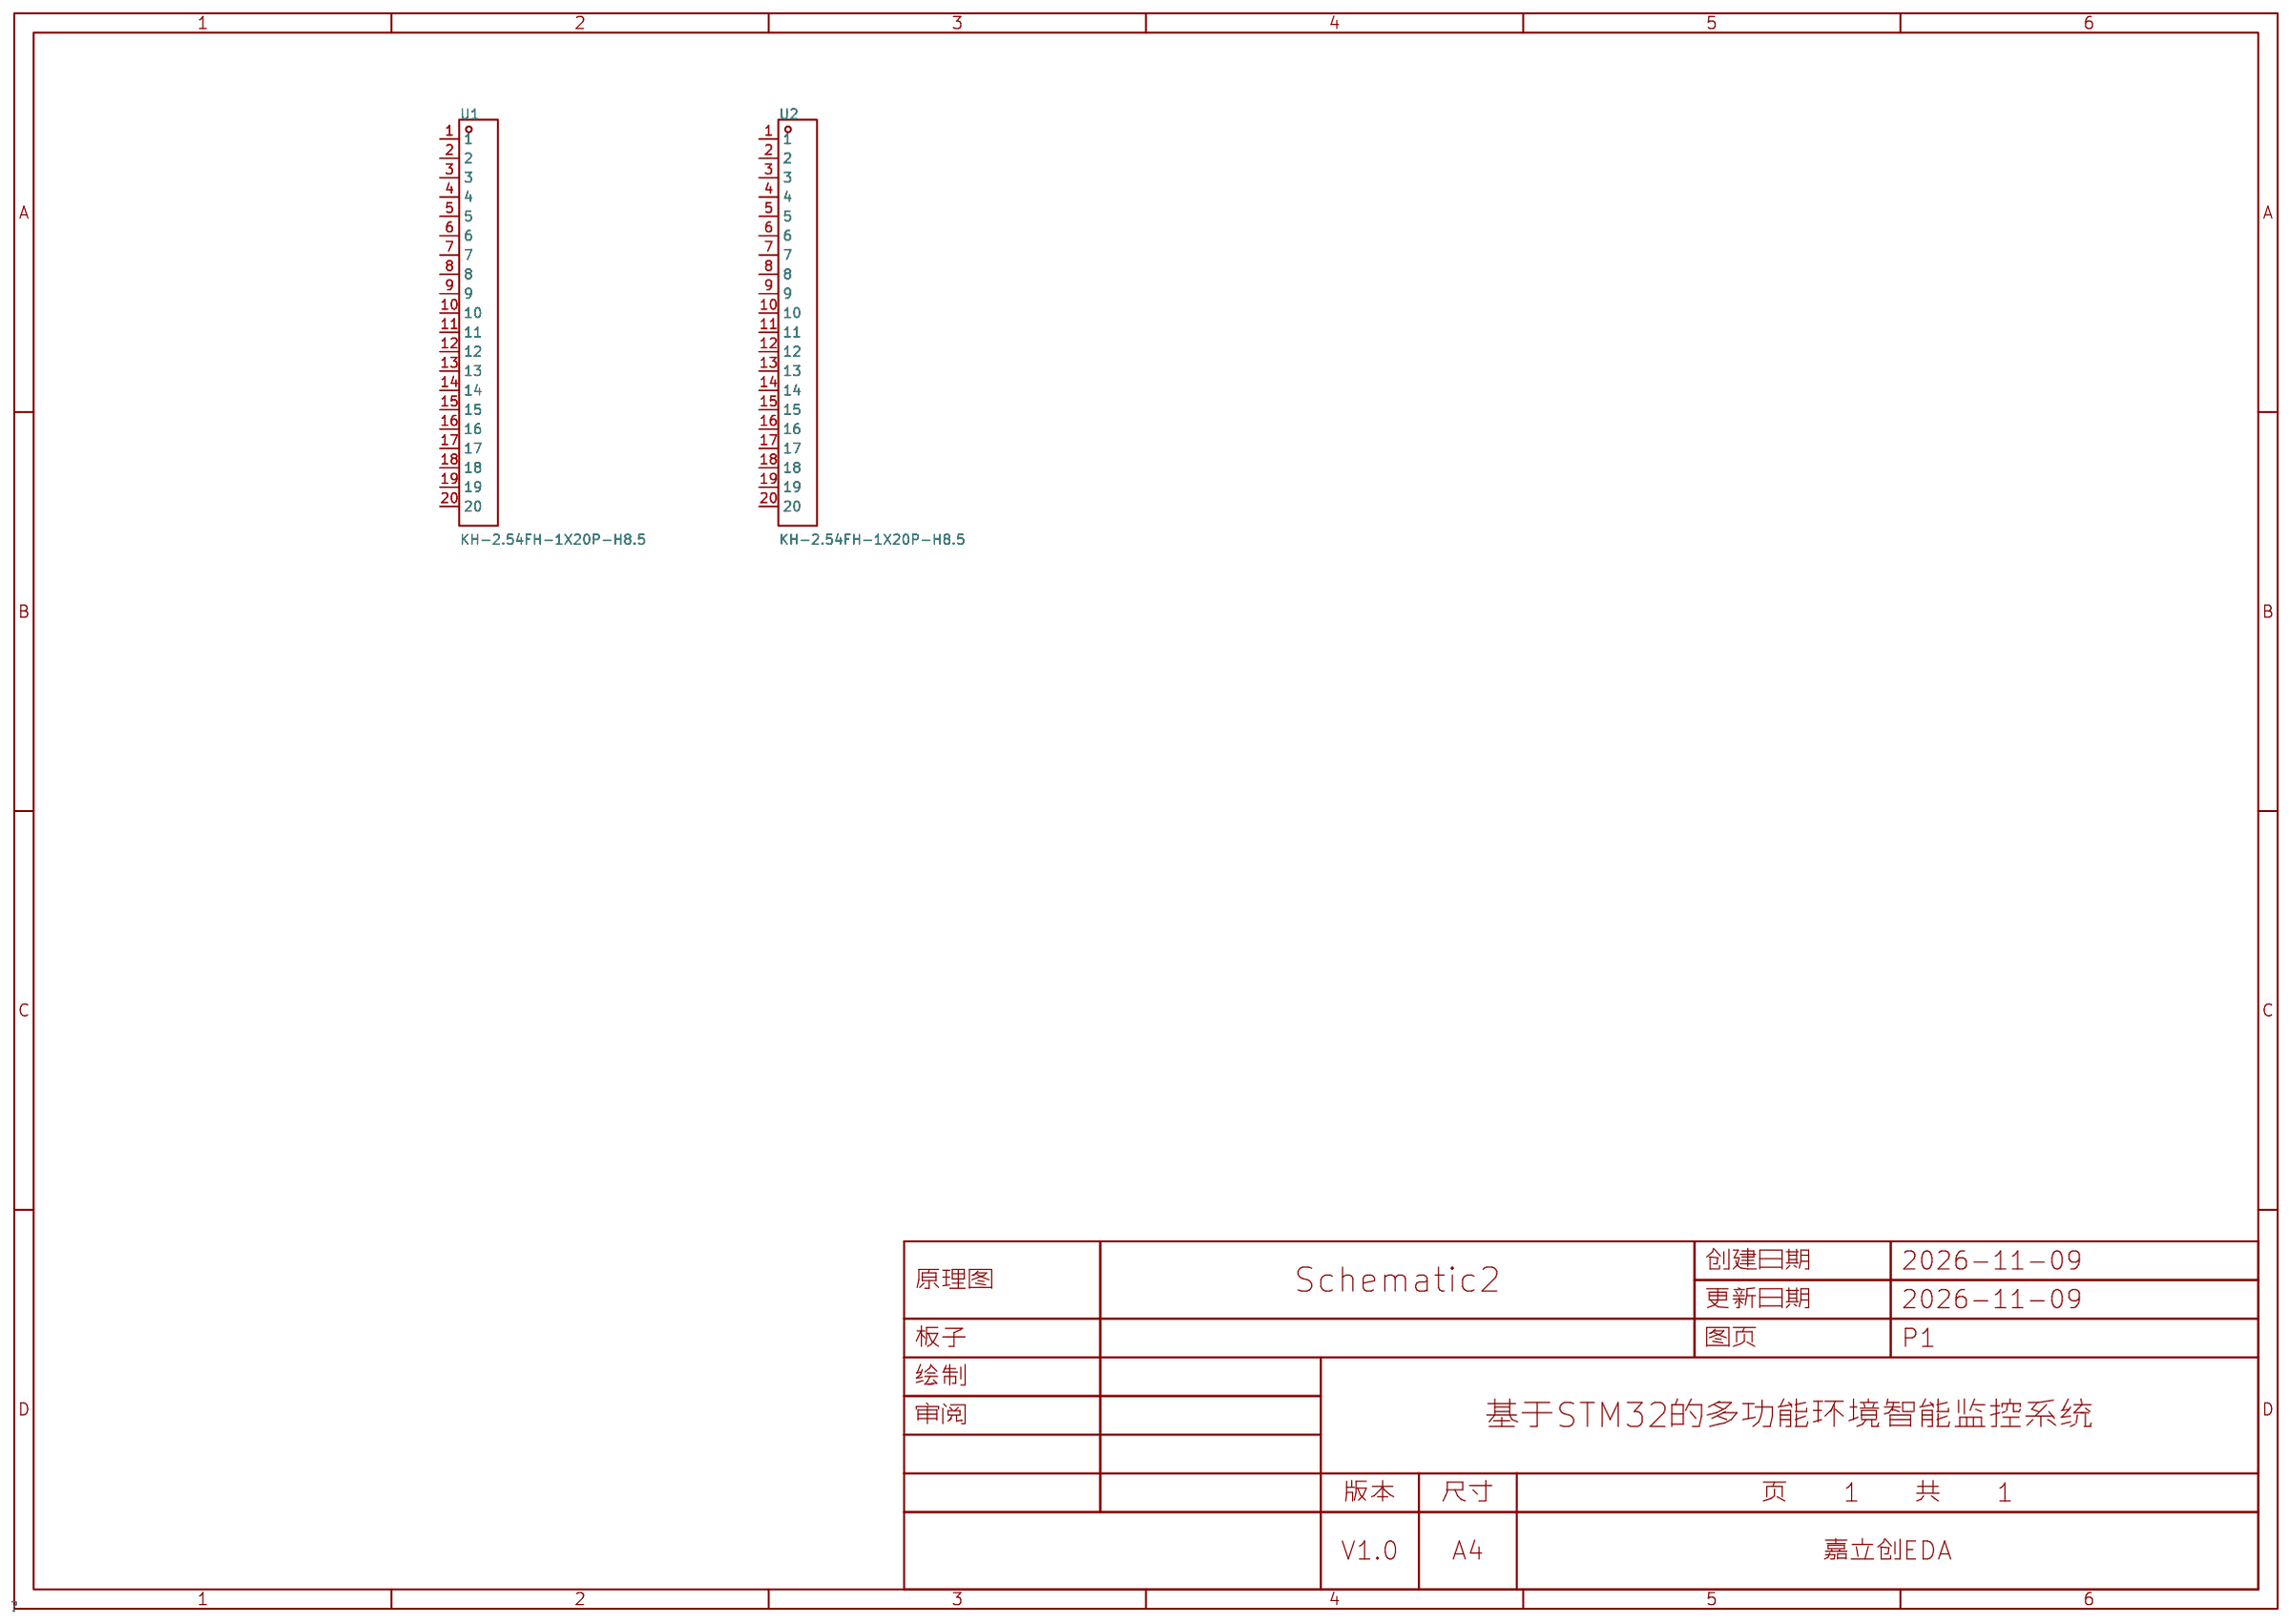
[diagram p3: schematic sheet]

## Parts
U1  KH-2.54FH-1X20P-H8.5  [HDR-TH_20P-P2.54-V-F-2]
U2  KH-2.54FH-1X20P-H8.5  [HDR-TH_20P-P2.54-V-F-2]

## Library data of the parts
U1 U2 = KH-2.54FH-1X20P-H8.5: 插孔结构:1x20P;间距:2.54mm;行距:-;圆孔/方孔:方孔;安装方式:直插;排数:单排;总孔位数:20P;额定电流:3A;额定电压:-;插孔方向:顶部;塑高:8.5mm;触头材质:黄铜;触头镀层:金;工作温度:-40℃~+105℃;; LCSC Part Name: 1x20P 间距:2.54mm 直插; Supplier Part: C2905423; Manufacturer: kinghelm(金航标); Supplier Footprint: 插件,P=2.54mm; JLCPCB Part Class: Extended Part; Datasheet: https://item.szlcsc.com/datasheet/KH-2.54FH-1X20P-H8.5/3175197.html; Supplier: LCSC; Holes Structure: 1x20P; Pitch: 2.54mm; Circular Hole / Square Hole: 方孔; Mounting Type: 直插; Number of Rows: 单排; Number of Positions: 20P; Current Rating: 3A; Holes Direction: 顶部; Insulation Height: 8.5mm; Contact Material: 黄铜; Contact Plating: 金; Operating Temperature: -40℃~+105℃; PIN Length: 3mm

## Nets

Not connected (* = marked no-connect by the designer): U1 1 2 3 4 5 6 7 8 9 10 11 12 13 14 15 16 17 18 19 20; U2 1 2 3 4 5 6 7 8 9 10 11 12 13 14 15 16 17 18 19 20

# Board PCB1
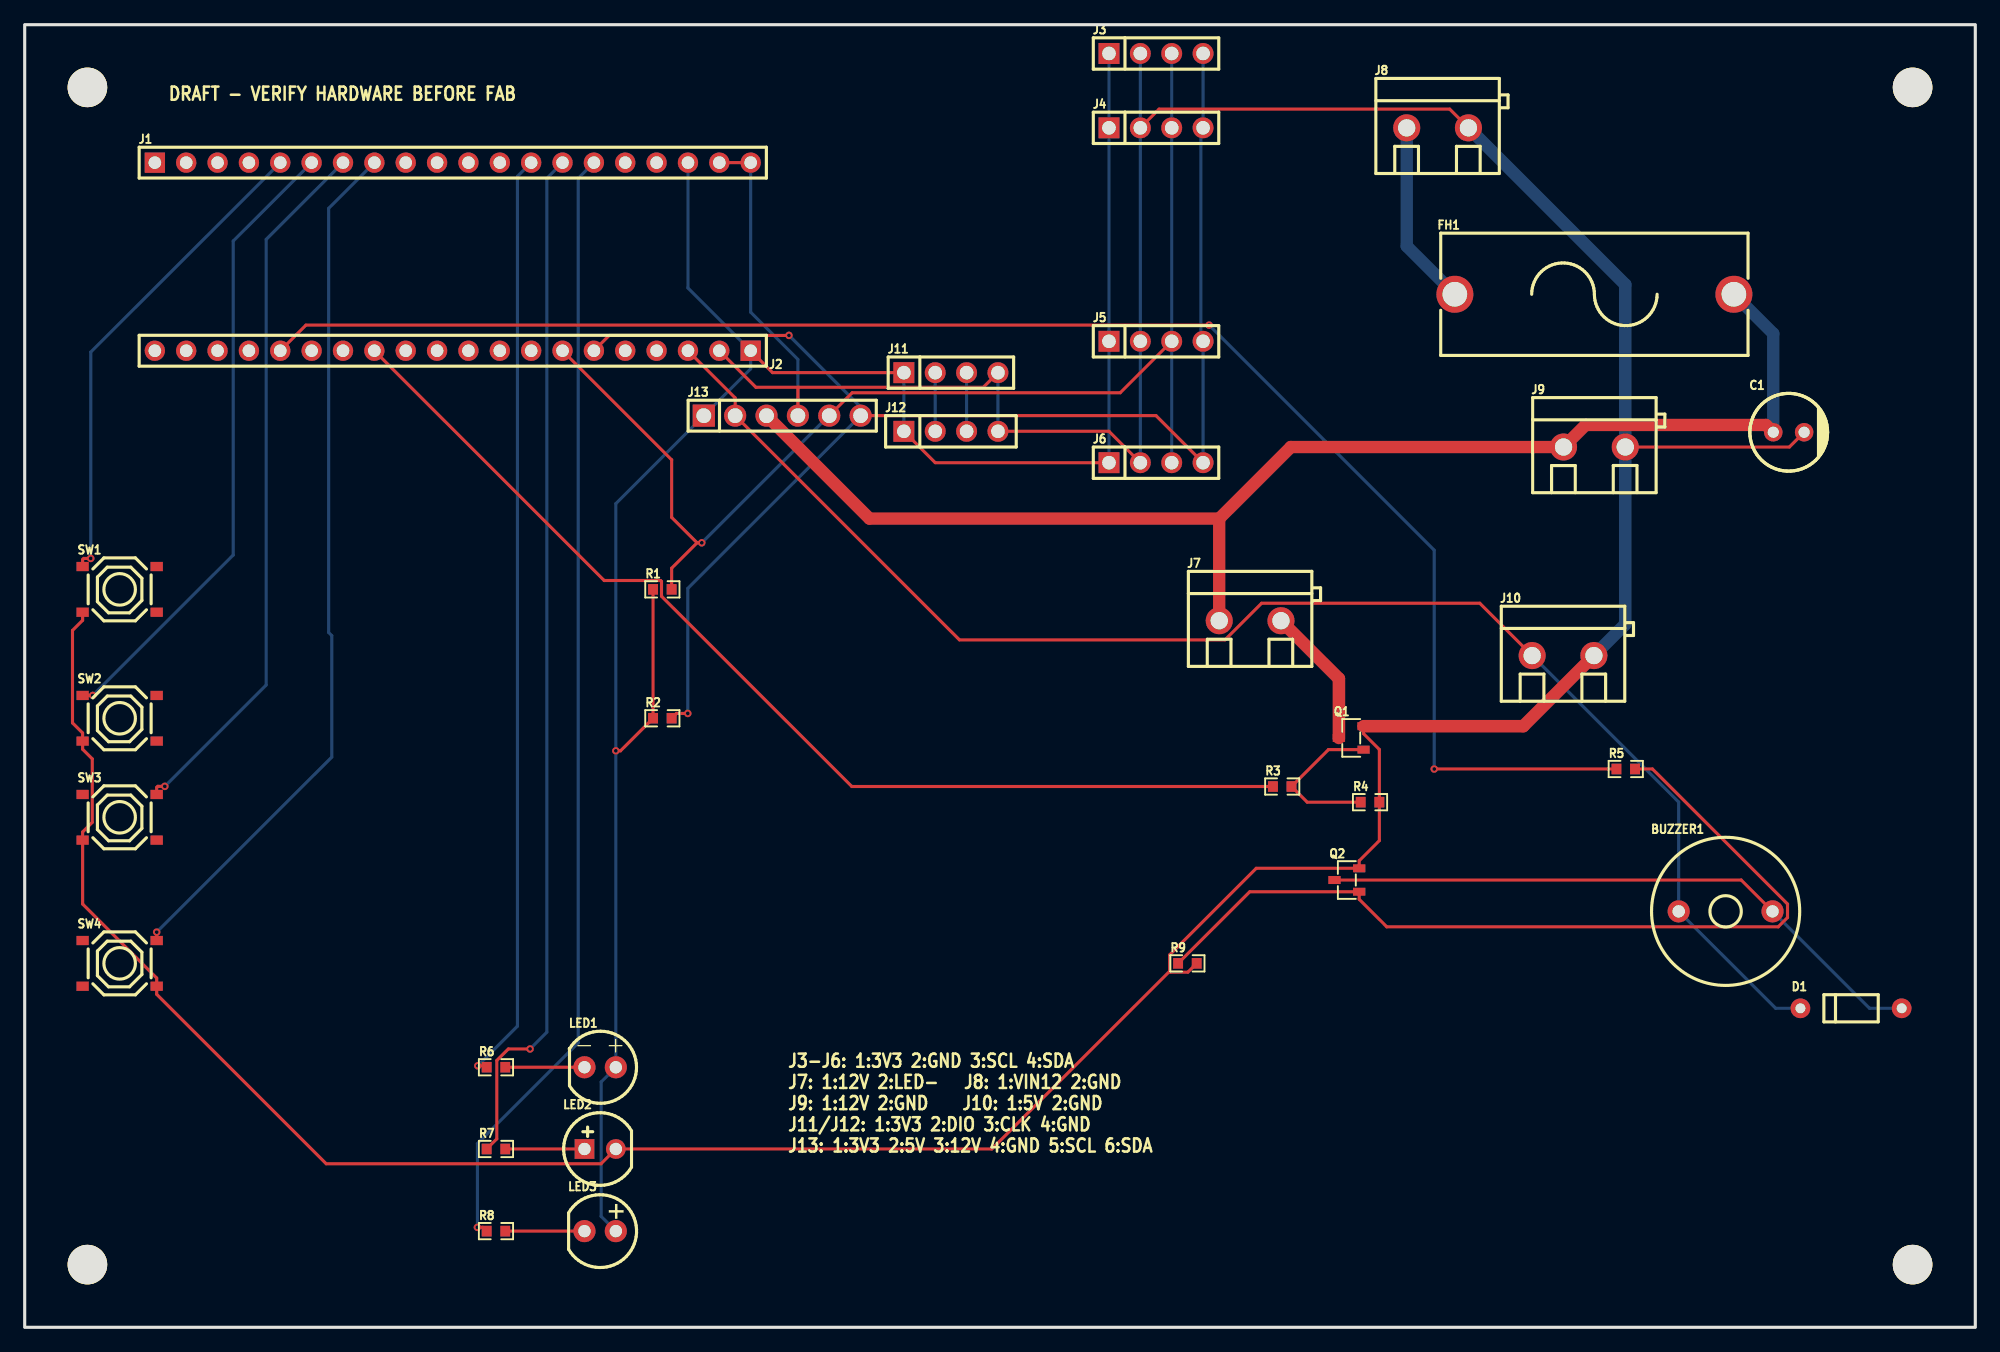
[diagram p4: board, top side]
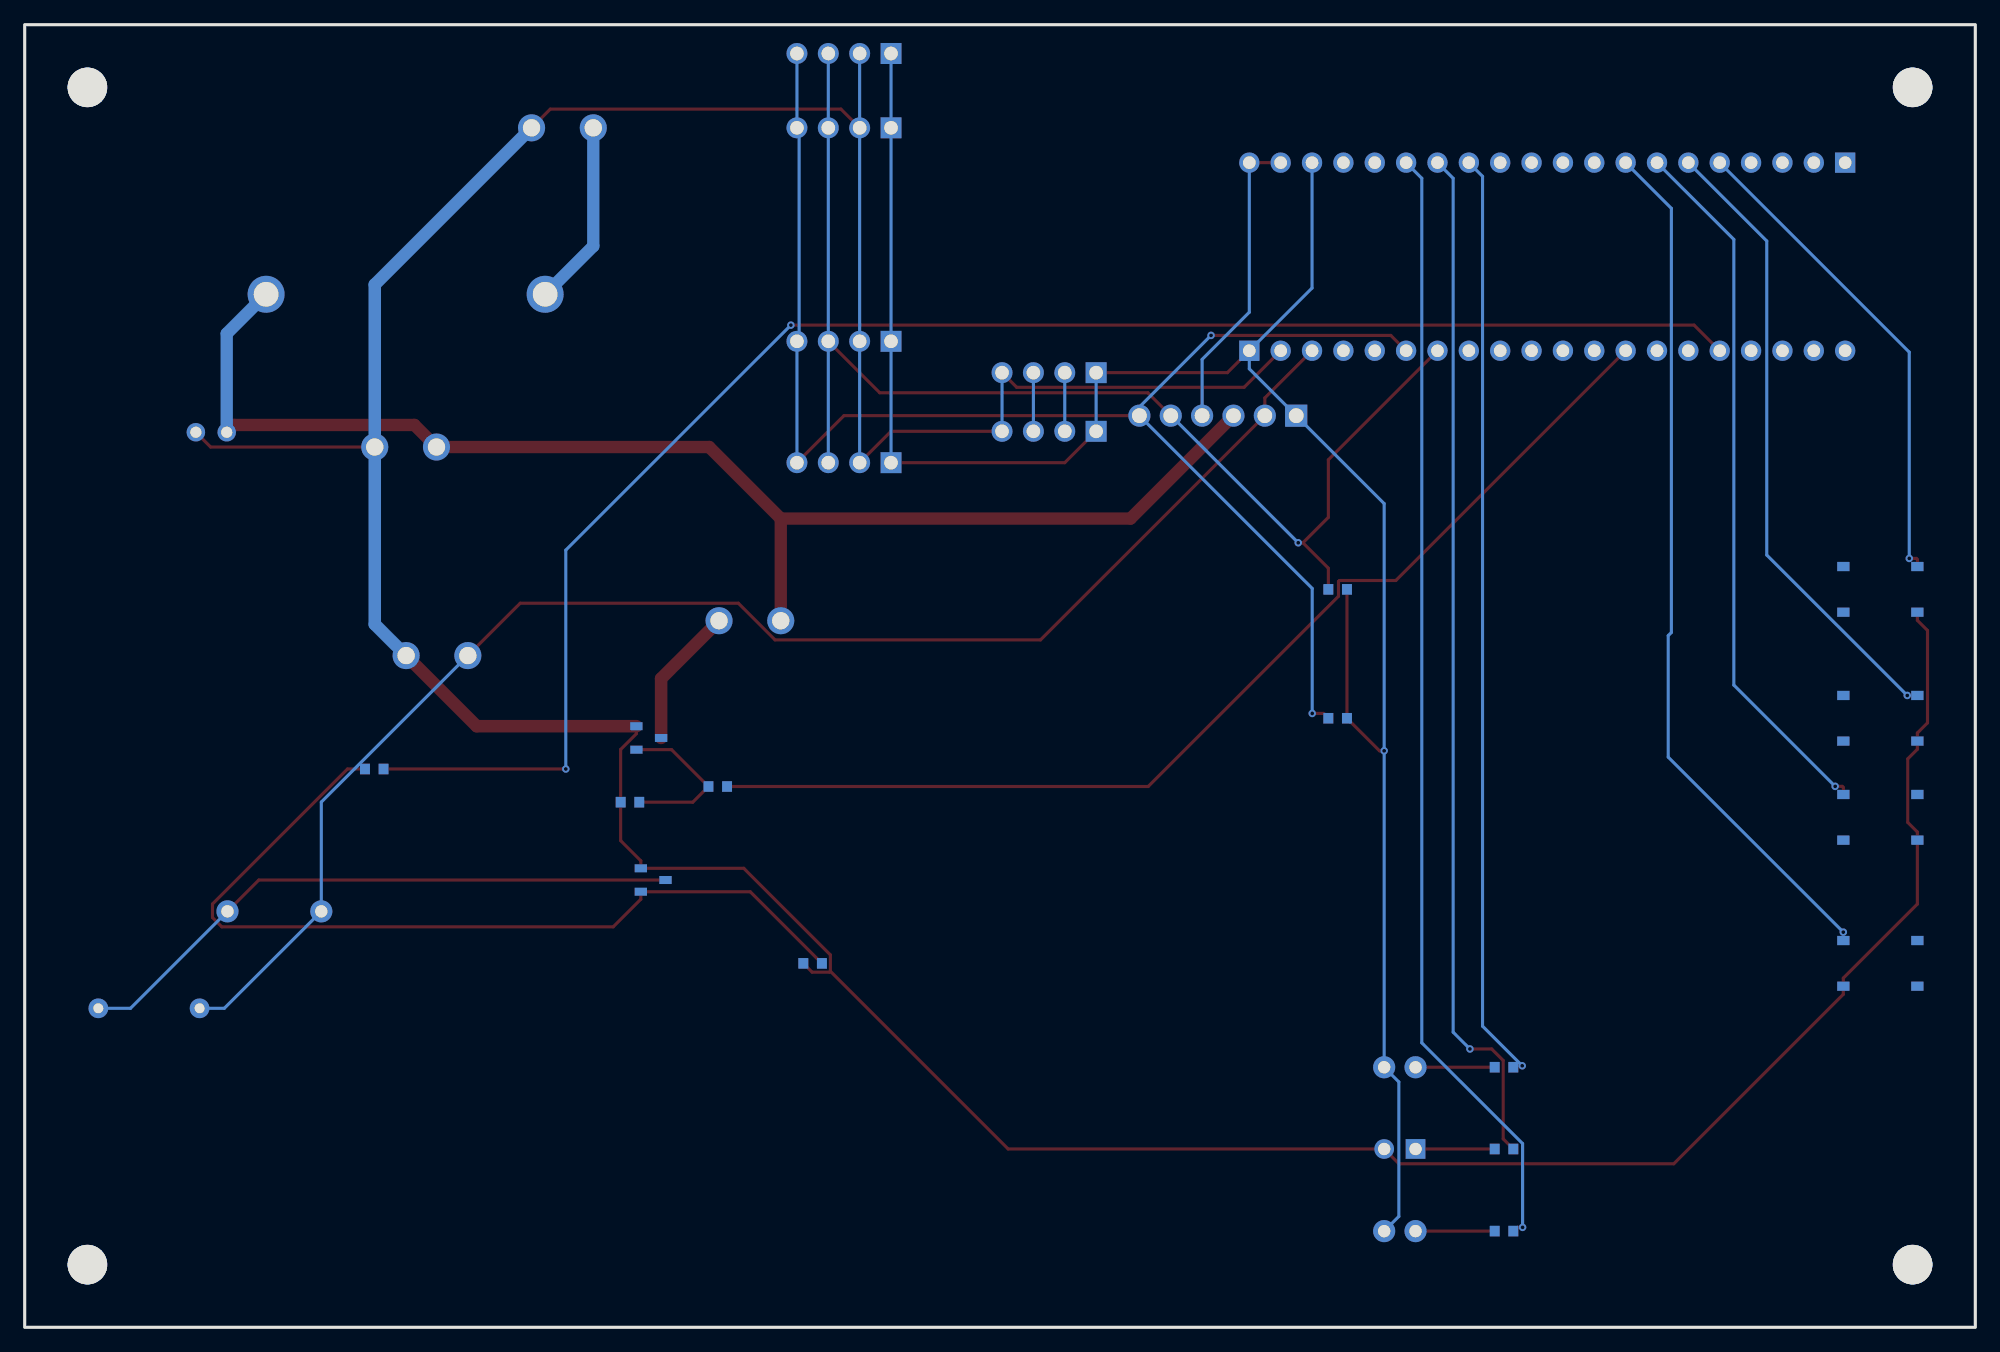
[diagram p5: board, bottom side, seen from below]

Outline 157.99 x 105.54 mm; copper layers: Top Layer, Bottom Layer. Coordinates in mm from the lower left corner of the outline.
Outline path: rectangle 0,105.54 157.99,0
Stack: Top Layer 0.035mm / Dielectric1 1.51mm FR4 er 4.5 / Bottom Layer 0.035mm

## Design rules (mm)
spacing copperThickness1oz (default): track to track 0.102, other pairs 0.152 to 0.3
spacing copperThickness2oz: track to track 0.203, other pairs 0.152 to 0.3
track width copperThickness1oz (default): min 0.127, default 0.254, max 2.54
track width copperThickness2oz: min 0.203, default 0.254, max 2.54
track width POWER_1A: min 0.127, default 1, max 2.54
differential pair differentialPair (default): width min 0.127, default 0.254, max 2.54; gap min 0.152, default 0.152
net +12V uses POWER_1A
net LAMP_NEG uses POWER_1A
net VIN_12V uses POWER_1A

## Placement (name value [footprint] x y rotation side)
BUZZER1  2.4kHz  [BUZ-TH_BD12.0-P7.60-D0.6-FD]  137.76 33.7 0 top
C1  100uF  [CAP-TH_BD6.3-P2.50-D0.5-FD]  142.88 72.52 0 top
D1  1N4148TR  [DO-35_BD2.0-L4.2-P8.20-D0.5-RD]  147.92 25.85 0 top
FH1  FUSE HOLDER + T2A 5x20  [FUSE-TH_L24.8-W9.8-P22.60]  127.14 83.69 0 top
J1  KH-2.54FH-1X20P-H8.5  [HDR-TH_20P-P2.54-V-F-2]  34.67 94.36 0 top
J2  KH-2.54FH-1X20P-H8.5  [HDR-TH_20P-P2.54-V-F-2]  34.67 79.12 180 top
J3  SHT30 0x44  [HDR-TH_4P-P2.54-V-M]  91.63 103.2 0 top
J4  BH1750 0x23  [HDR-TH_4P-P2.54-V-M]  91.63 97.18 0 top
J5  OLED SSD1306 0x3C  [HDR-TH_4P-P2.54-V-M]  91.63 79.89 0 top
J6  DS3231 0x68  [HDR-TH_4P-P2.54-V-M]  91.63 70.05 0 top
J7  12V LED STRIP 1A  [CONN-TH_P5.00_KF301-5.0-2P]  99.25 57.25 0 top
J8  12V DC INPUT  [CONN-TH_P5.00_KF301-5.0-2P]  114.44 97.18 0 top
J9  LM2596 IN 12V  [CONN-TH_P5.00_KF301-5.0-2P]  127.14 71.32 0 top
J10  LM2596 OUT 5V  [CONN-TH_P5.00_KF301-5.0-2P]  124.6 54.42 0 top
J11  ST-LINK SWD  [HDR-TH_4P-P2.54-V-M]  75.02 77.34 0 top
J12  BLUE PILL SWD  [HDR-TH_4P-P2.54-V-F]  75.02 72.59 0 top
J13  2.54-1x6P直针  [HDR-TH_6P-P2.54-V-M-1]  61.35 73.86 0 top
LED1  XL-502SURD  [LED-TH_BD5.9-P2.54-RD_RED]  46.61 21.07 0 top
LED2  XL-502SYGD  [LED-TH_BD5.8-P2.54-RD]  46.61 14.45 0 top
LED3  XL-502UYD  [LED-TH_BD5.9-P2.54-RD_YELLOW]  46.61 7.79 0 top
NOREF  -  [Pad_e365]  152.91 5.08 0 top
NOREF#2  -  [Pad_e363]  152.91 100.46 0 top
NOREF#3  -  [Pad_e364]  5.08 5.08 0 top
NOREF#4  -  [Pad_e362]  5.08 100.46 0 top
Q1  AO3400A  [SOT-23-3_L2.9-W1.3-P1.90-LS2.4-BR]  107.44 47.75 0 top
Q2  S8050(0.5A)  [SOT-23-3_L2.9-W1.3-P1.90-LS2.4-BR]  107.09 36.24 0 top
R1  4.7kΩ  [R0603]  51.65 59.79 0 top
R2  4.7kΩ  [R0603]  51.65 49.34 0 top
R3  100Ω  [R0603]  101.85 43.81 0 top
R4  10kΩ  [R0603]  108.97 42.55 0 top
R5  1kΩ  [R0603]  129.68 45.23 0 top
R6  330Ω  [R0603]  38.17 21.07 0 top
R7  330Ω  [R0603]  38.17 14.45 0 top
R8  330Ω  [R0603]  38.17 7.79 0 top
R9  100kΩ  [R0603]  94.17 29.49 0 top
SW1  TS-1187A-B-A-B  [SW-SMD_4P-L5.1-W5.1-P3.70-LS6.5-TL_H1.5]  7.69 59.79 0 top
SW2  TS-1187A-B-A-B  [SW-SMD_4P-L5.1-W5.1-P3.70-LS6.5-TL_H1.5]  7.69 49.34 0 top
SW3  TS-1187A-B-A-B  [SW-SMD_4P-L5.1-W5.1-P3.70-LS6.5-TL_H1.5]  7.69 41.32 0 top
SW4  TS-1187A-B-A-B  [SW-SMD_4P-L5.1-W5.1-P3.70-LS6.5-TL_H1.5]  7.69 29.49 0 top

## Footprints (pads in the part's own frame, mm; a bottom-side part is the same pattern mirrored in y, then rotated)
BUZ-TH_BD12.0-P7.60-D0.6-FD
  round 1.8 hole 1: 1(-3.8,0) 2(3.8,0)
CAP-TH_BD6.3-P2.50-D0.5-FD
  round 1.5 hole 0.9: 1(-1.25,0) 2(1.25,0)
CONN-TH_P5.00_KF301-5.0-2P
  round 2.2 hole 1.4: 1(-2.5,0) 2(2.5,0)
DO-35_BD2.0-L4.2-P8.20-D0.5-RD
  round 1.6 hole 0.8: 1(-4.1,0) 2(4.1,0)
FUSE-TH_L24.8-W9.8-P22.60
  round 3 hole 2: 1(-11.3,0) 2(11.3,0)
HDR-TH_4P-P2.54-V-F
  rect 1.7x1.7 hole 1.1: 1(-3.81,0)
  round 1.7 hole 1.1: 2(-1.27,0) 3(1.27,0) 4(3.81,0)
HDR-TH_4P-P2.54-V-M
  rect 1.7x1.7 hole 1.1: 1(-3.81,0)
  round 1.7 hole 1.1: 2(-1.27,0) 3(1.27,0) 4(3.81,0)
HDR-TH_6P-P2.54-V-M-1
  rect 1.8x1.8 hole 1.2: 1(-6.35,0)
  round 1.8 hole 1.2: 2(-3.81,0) 3(-1.27,0) 4(1.27,0) 5(3.81,0) 6(6.35,0)
HDR-TH_20P-P2.54-V-F-2
  rect 1.65x1.65 hole 1.02: 1(-24.13,0)
  round 1.65 hole 1.02: 2(-21.59,0) 3(-19.05,0) 4(-16.51,0) 5(-13.97,0) 6(-11.43,0) 7(-8.89,0) 8(-6.35,0) 9(-3.81,0) 10(-1.27,0) 11(1.27,0) 12(3.81,0) 13(6.35,0) 14(8.89,0) 15(11.43,0) 16(13.97,0) 17(16.51,0) 18(19.05,0) 19(21.59,0) 20(24.13,0)
LED-TH_BD5.8-P2.54-RD
  round 1.6 hole 1: 1(1.27,0)
  rect 1.6x1.6 hole 1: 2(-1.27,0)
LED-TH_BD5.9-P2.54-RD_RED
  round 1.8 hole 1: 1(-1.27,0) 2(1.27,0)
LED-TH_BD5.9-P2.54-RD_YELLOW
  round 1.8 hole 1: 1(-1.27,0) 2(1.27,0)
Pad_e362
  round 3.2 hole 3.2: 1(0,0)
Pad_e363
  round 3.2 hole 3.2: 1(0,0)
Pad_e364
  round 3.2 hole 3.2: 1(0,0)
Pad_e365
  round 3.2 hole 3.2: 2(0,0)
R0603
  rect 0.806x0.864 hole 0.001: 1(-0.753,0) 2(0.753,0)
SOT-23-3_L2.9-W1.3-P1.90-LS2.4-BR
  rect 1x0.65 hole 0.001: 1(1,-0.95) 2(1,0.95) 3(-1,0)
SW-SMD_4P-L5.1-W5.1-P3.70-LS6.5-TL_H1.5
  rect 1x0.75 hole 0.001: 1(-3,1.85) 2(3,1.85) 3(-3,-1.85) 4(3,-1.85)

## Nets
As in the schematic.

Pads without a net: J1 1 2 3 4 9 10 11 12 16 17; J2 4 5 8 9 10 11 12 14 15 17 18 19 20; NOREF 2; NOREF#2 1; NOREF#3 1; NOREF#4 1; SW1 2 4; SW2 2 4; SW3 1 4; SW4 1 3

## Via types
v1: diameter 0.61, hole 0.305, Top Layer to Bottom Layer, 13 vias

## Routing (per net, layer and track width the routed paths; a pad name or vN(x,y) marks a point on that pad's centre or on a via; arc(x,y) is an arc through that point)
+3V3: length 177.4
  Top Layer w0.254: R1.1 R2.1 48.26,46.71 v1(47.88,46.71) ; J6.1 73.75,70.05 J12.1 ; J2.1 60.58,77.34 J11.1
  Bottom Layer w0.254: J3.1 J4.1 J5.1 J6.1 ; J12.1 J11.1 ; J1.18 53.72,84.2 J2.1 58.8,77.66 J13.1 47.88,66.74 v1(47.88,46.71) LED1.2 46.69,19.88 46.69,8.98 LED3.2
+5V: length 120.7
  Top Layer w0.254: J2.3 57.54,75.3 J13.2 75.71,55.7 97.22,55.7 100.19,58.67 117.85,58.67 J10.1
  Bottom Layer w0.254: J10.1 133.96,42.55 133.96,33.7 141.82,25.85 D1.1
+12V: length 109.2
  Top Layer w1: C1.1 141.03,73.11 126.42,73.11 J9.1 102.55,71.32 96.75,65.52 ; 96.75,65.52 68.42,65.52 J13.3 ; 96.75,65.52 J7.1
  Bottom Layer w1: C1.1 141.62,80.51 FH1.2
GND: length 378.4
  Top Layer w0.254: C1.2 142.93,71.32 J9.2 ; J6.2 87.82,72.59 J12.4 ; J8.2 115.42,98.7 91.88,98.7 J4.2 ; J1.19 J1.20 ; 62.62,76.16 59.23,76.16 J2.2 ; 62.62,76.16 77.64,76.16 J11.4 ; 62.62,76.16 J13.4 ; 92.73,28.85 78.33,14.45 LED2.1 46.68,13.25 24.42,13.25 10.69,26.98 SW4.4 10.69,28.29 4.69,34.3 SW3.3 4.69,40.13 5.47,40.91 5.47,46.05 4.69,46.83 SW2.3 4.69,48.15 3.87,48.97 3.87,56.46 4.69,57.28 SW1.3 ; 92.73,28.85 92.81,28.77 94.21,28.77 R9.2 ; 92.73,28.85 92.73,30.17 99.75,37.19 Q2.2 108.09,37.8 109.72,39.43 R4.2 109.72,46.82 108.44,48.09 Q1.2
  Top Layer w1.016: J10.2 121.38,48.7 Q1.2
  Bottom Layer w0.254: J1.20 58.8,82.24 62.62,78.42 J13.4 ; J6.2 J5.2 J4.2 J3.2 ; J12.4 J11.4
  Bottom Layer w1.016: J8.2 129.64,84.48 J9.2 129.64,56.96 J10.2
VIN_12V: length 15.1
  Bottom Layer w1: FH1.1 111.94,87.6 J8.1
BUZZ_BASE: length 71.6
  Top Layer w0.254: R5.2 131.84,45.23 142.78,34.3 142.78,33.2 142.02,32.45 110.32,32.45 108.09,34.68 Q2.1 99.22,35.29 R9.1
BUZZ_NEG: length 50.2
  Top Layer w0.254: 141.56,33.7 139.02,36.24 106.09,36.24
  Bottom Layer w0.254: D1.2 149.42,25.85 141.56,33.7
BUZZER_PA8: length 134.4
  Top Layer w0.254: v1(95.93,81.2) 22.78,81.2 J2.16 ; R5.1 v1(114.16,45.23)
  Bottom Layer w0.254: v1(114.16,45.23) 114.16,62.97 v1(95.93,81.2)
I2C1_SCL: length 103.1
  Top Layer w0.254: J5.3 88.73,75.72 67.02,75.72 J13.5 ; R1.2 52.4,61.5 54.46,63.56 ; J2.7 52.4,70.28 52.4,65.62 54.46,63.56 ; 54.46,63.56 v1(54.84,63.56)
  Bottom Layer w0.254: v1(54.84,63.56) 65.14,73.86 J13.5 ; J6.3 J5.3 J4.3 J3.3
I2C1_SDA: length 119.2
  Top Layer w0.254: J13.6 91.63,73.86 J6.4 ; R2.2 52.79,49.74 v1(53.71,49.74) ; J2.6 47.34,80.36 v1(61.9,80.36)
  Bottom Layer w0.254: v1(61.9,80.36) 67.7,74.56 J13.6 53.71,59.86 v1(53.71,49.74) ; J3.4 J4.4 95.27,97 95.27,80.06 J5.4 J6.4
KEY1_PA0: length 39.7
  Top Layer w0.254: v1(5.35,62.3) 4.78,62.3 4.69,62.21 SW1.1
  Bottom Layer w0.254: v1(5.35,62.3) 5.35,79.01 J1.5
KEY2_PA1: length 51.3
  Top Layer w0.254: SW2.1 v1(5.51,51.19)
  Bottom Layer w0.254: v1(5.51,51.19) 16.89,62.57 16.89,88.01 J1.6
KEY3_PA2: length 57.8
  Top Layer w0.254: v1(11.35,43.83) 10.78,43.83 10.69,43.74 SW3.2
  Bottom Layer w0.254: J1.7 19.56,88.14 19.56,52.04 v1(11.35,43.83)
KEY4_PA3: length 70.5
  Top Layer w0.254: v1(10.69,32.02) SW4.2
  Bottom Layer w0.254: v1(10.69,32.02) 24.87,46.2 24.87,56.04 24.62,56.3 24.62,90.66 J1.8
LAMP_NEG: length 11.4
  Top Layer w1.016: J7.2 106.44,52.56 Q1.3
LED_GREEN_PB1: length 83.5
  Top Layer w0.254: R7.1 38.24,15.27 38.24,21.62 39.17,22.55 v1(40.93,22.55)
  Bottom Layer w0.254: J1.14 42.29,93.09 42.29,23.91 v1(40.93,22.55)
LED_RED_PB0: length 75.7
  Top Layer w0.254: v1(36.7,21.19) 37.3,21.19 R6.1
  Bottom Layer w0.254: v1(36.7,21.19) 39.91,24.4 39.91,93.25 J1.13
LED_YELLOW_PB10: length 91
  Top Layer w0.254: R8.1 37.11,8.1 v1(36.67,8.1)
  Bottom Layer w0.254: J1.15 44.83,93.09 44.83,23.05 36.67,14.89 v1(36.67,8.1)
LIGHT_GATE: length 13.2
  Top Layer w0.254: Q1.1 105.59,46.8 R3.2 103.88,42.55 R4.1
LIGHT_PA11: length 88.1
  Top Layer w0.254: R3.1 66.99,43.81 51.58,59.23 51.58,60.43 51.5,60.5 46.94,60.5 J2.13
SWCLK_PA14: length 4.8
  Bottom Layer w0.254: J12.3 J11.3
SWDIO_PA13: length 4.8
  Bottom Layer w0.254: J12.2 J11.2
$1N72: length 6.4
  Top Layer w0.254: LED1.1 R6.2
$1N73: length 6.4
  Top Layer w0.254: R7.2 LED2.2
$1N74: length 6.4
  Top Layer w0.254: LED3.1 R8.2

## Text on the board
Document Layer: DRAFT - VERIFY HARDWARE BEFORE FABRICATION
Top Silkscreen Layer: DRAFT - VERIFY HARDWARE BEFORE FAB | J3-J6: 1:3V3 2:GND 3:SCL 4:SDA / J7: 1:12V 2:LED-   J8: 1:VIN12 2:GND / J9: 1:12V 2:GND    J10: 1:5V 2:GND / J11/J12: 1:3V3 2:DIO 3:CLK 4:GND / J13: 1:3V3 2:5V 3:12V 4:GND 5:SCL 6:SDA
